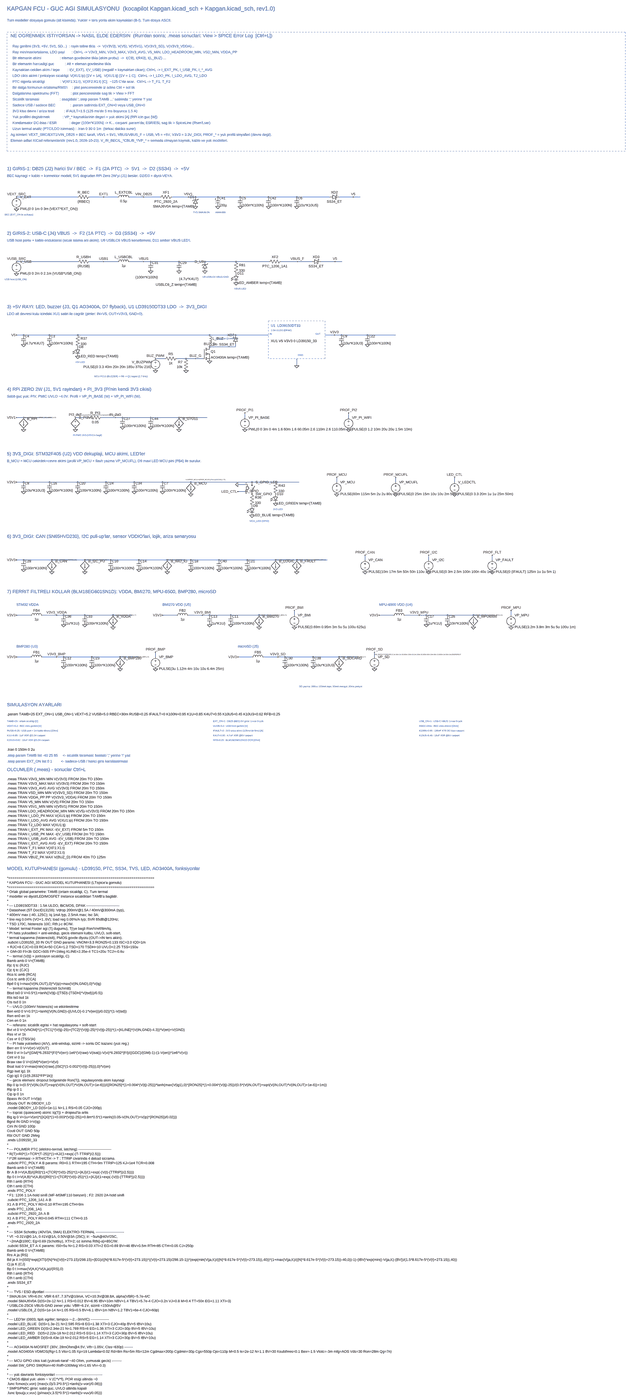
[diagram p0: schematic Kapgan_Guc_Agi.asc, whole sheet]
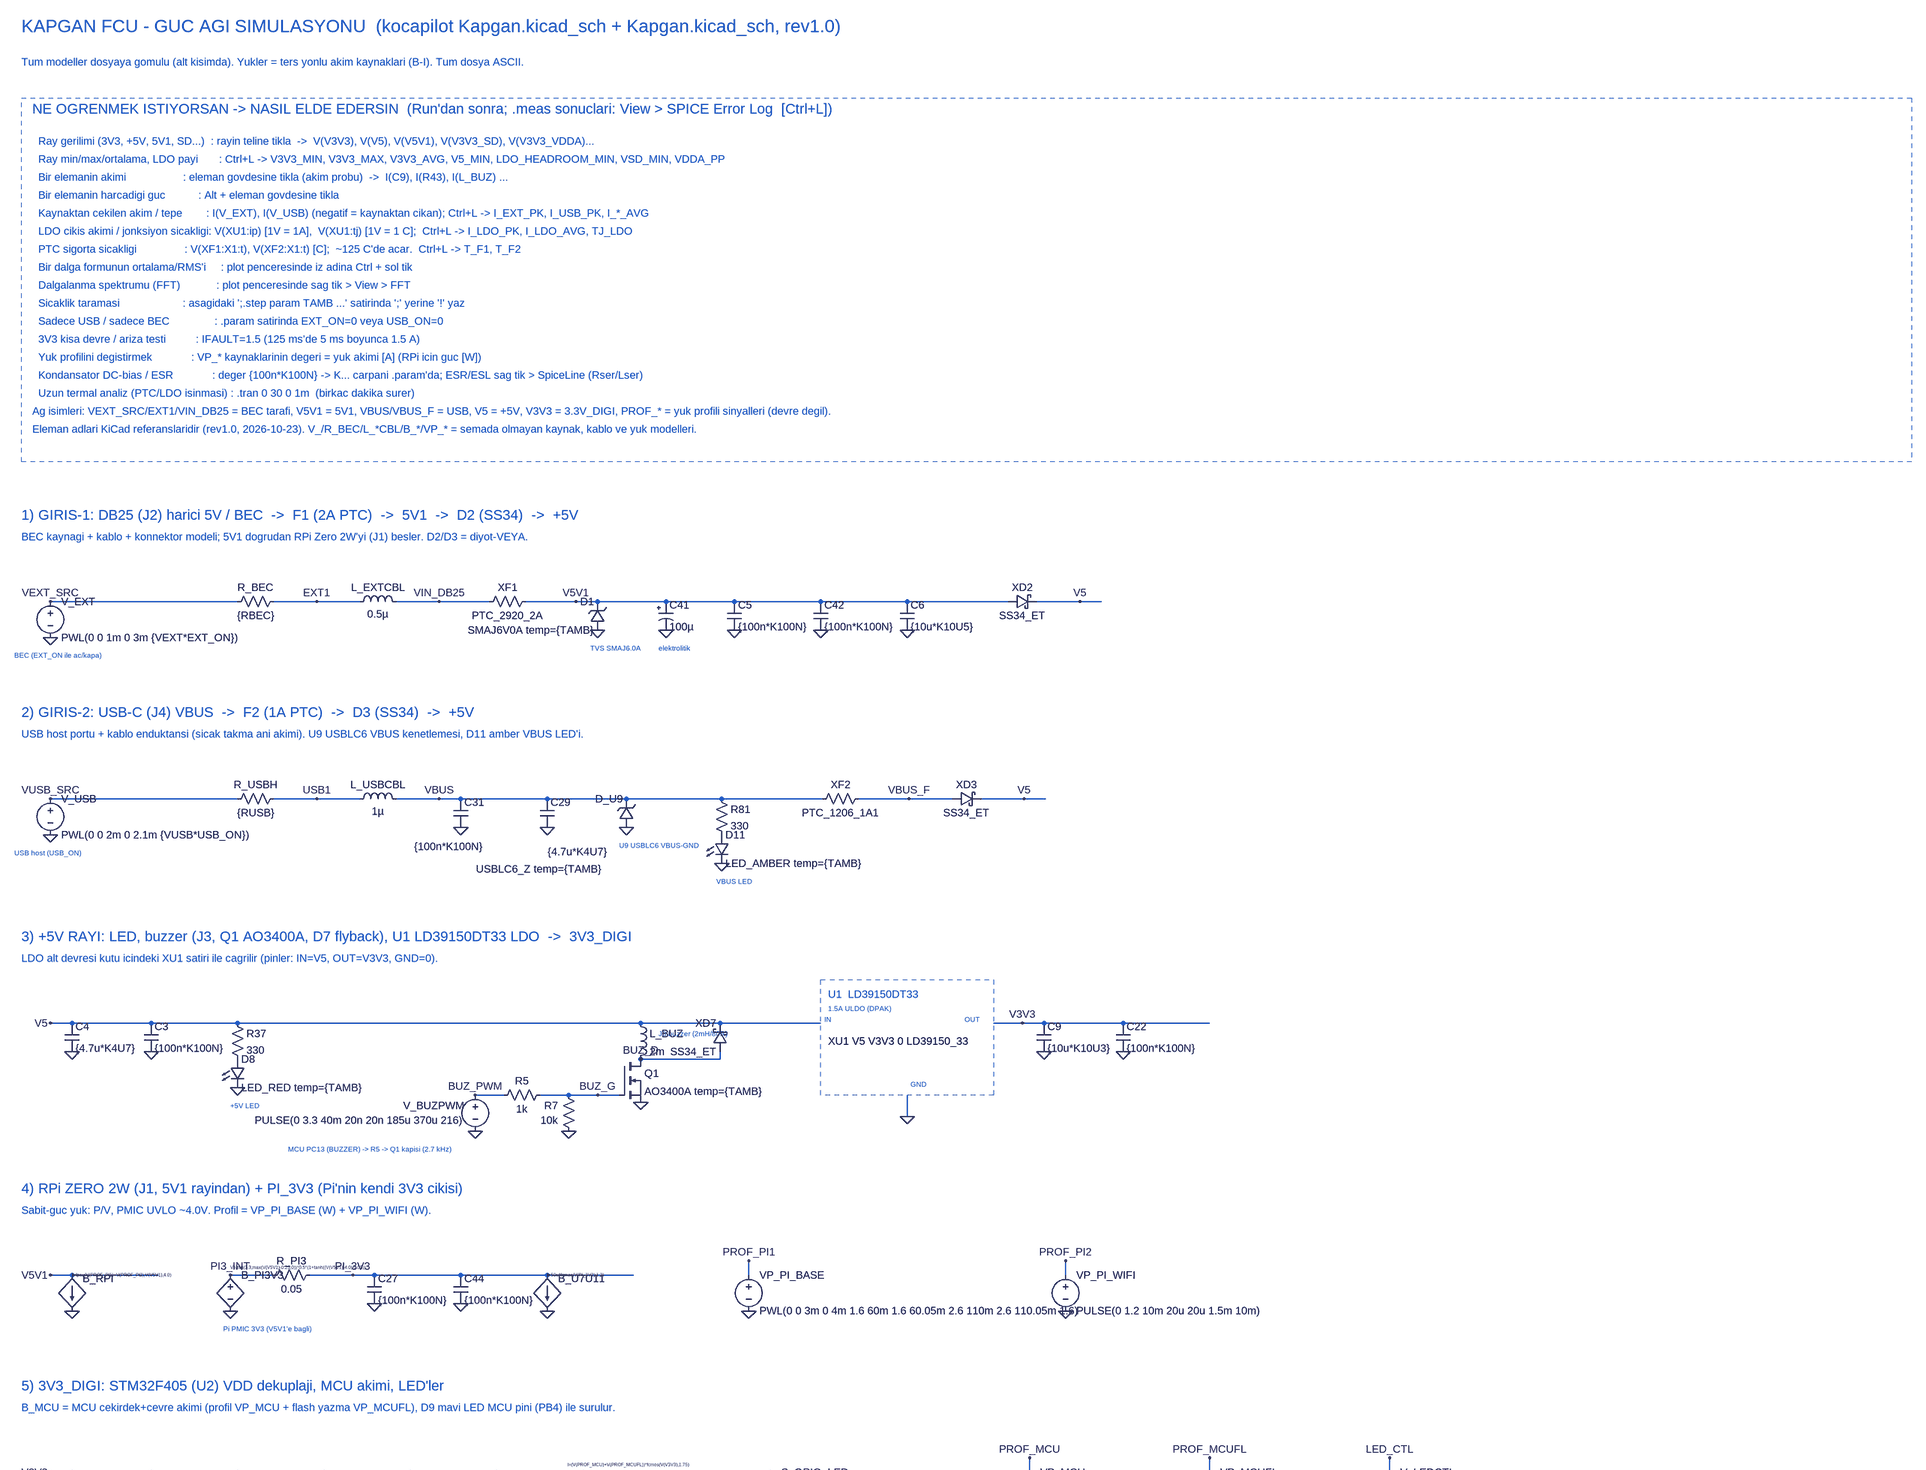
[diagram p1: schematic Kapgan_Guc_Agi.asc, part, row 1 of 3, column 1 of 1]
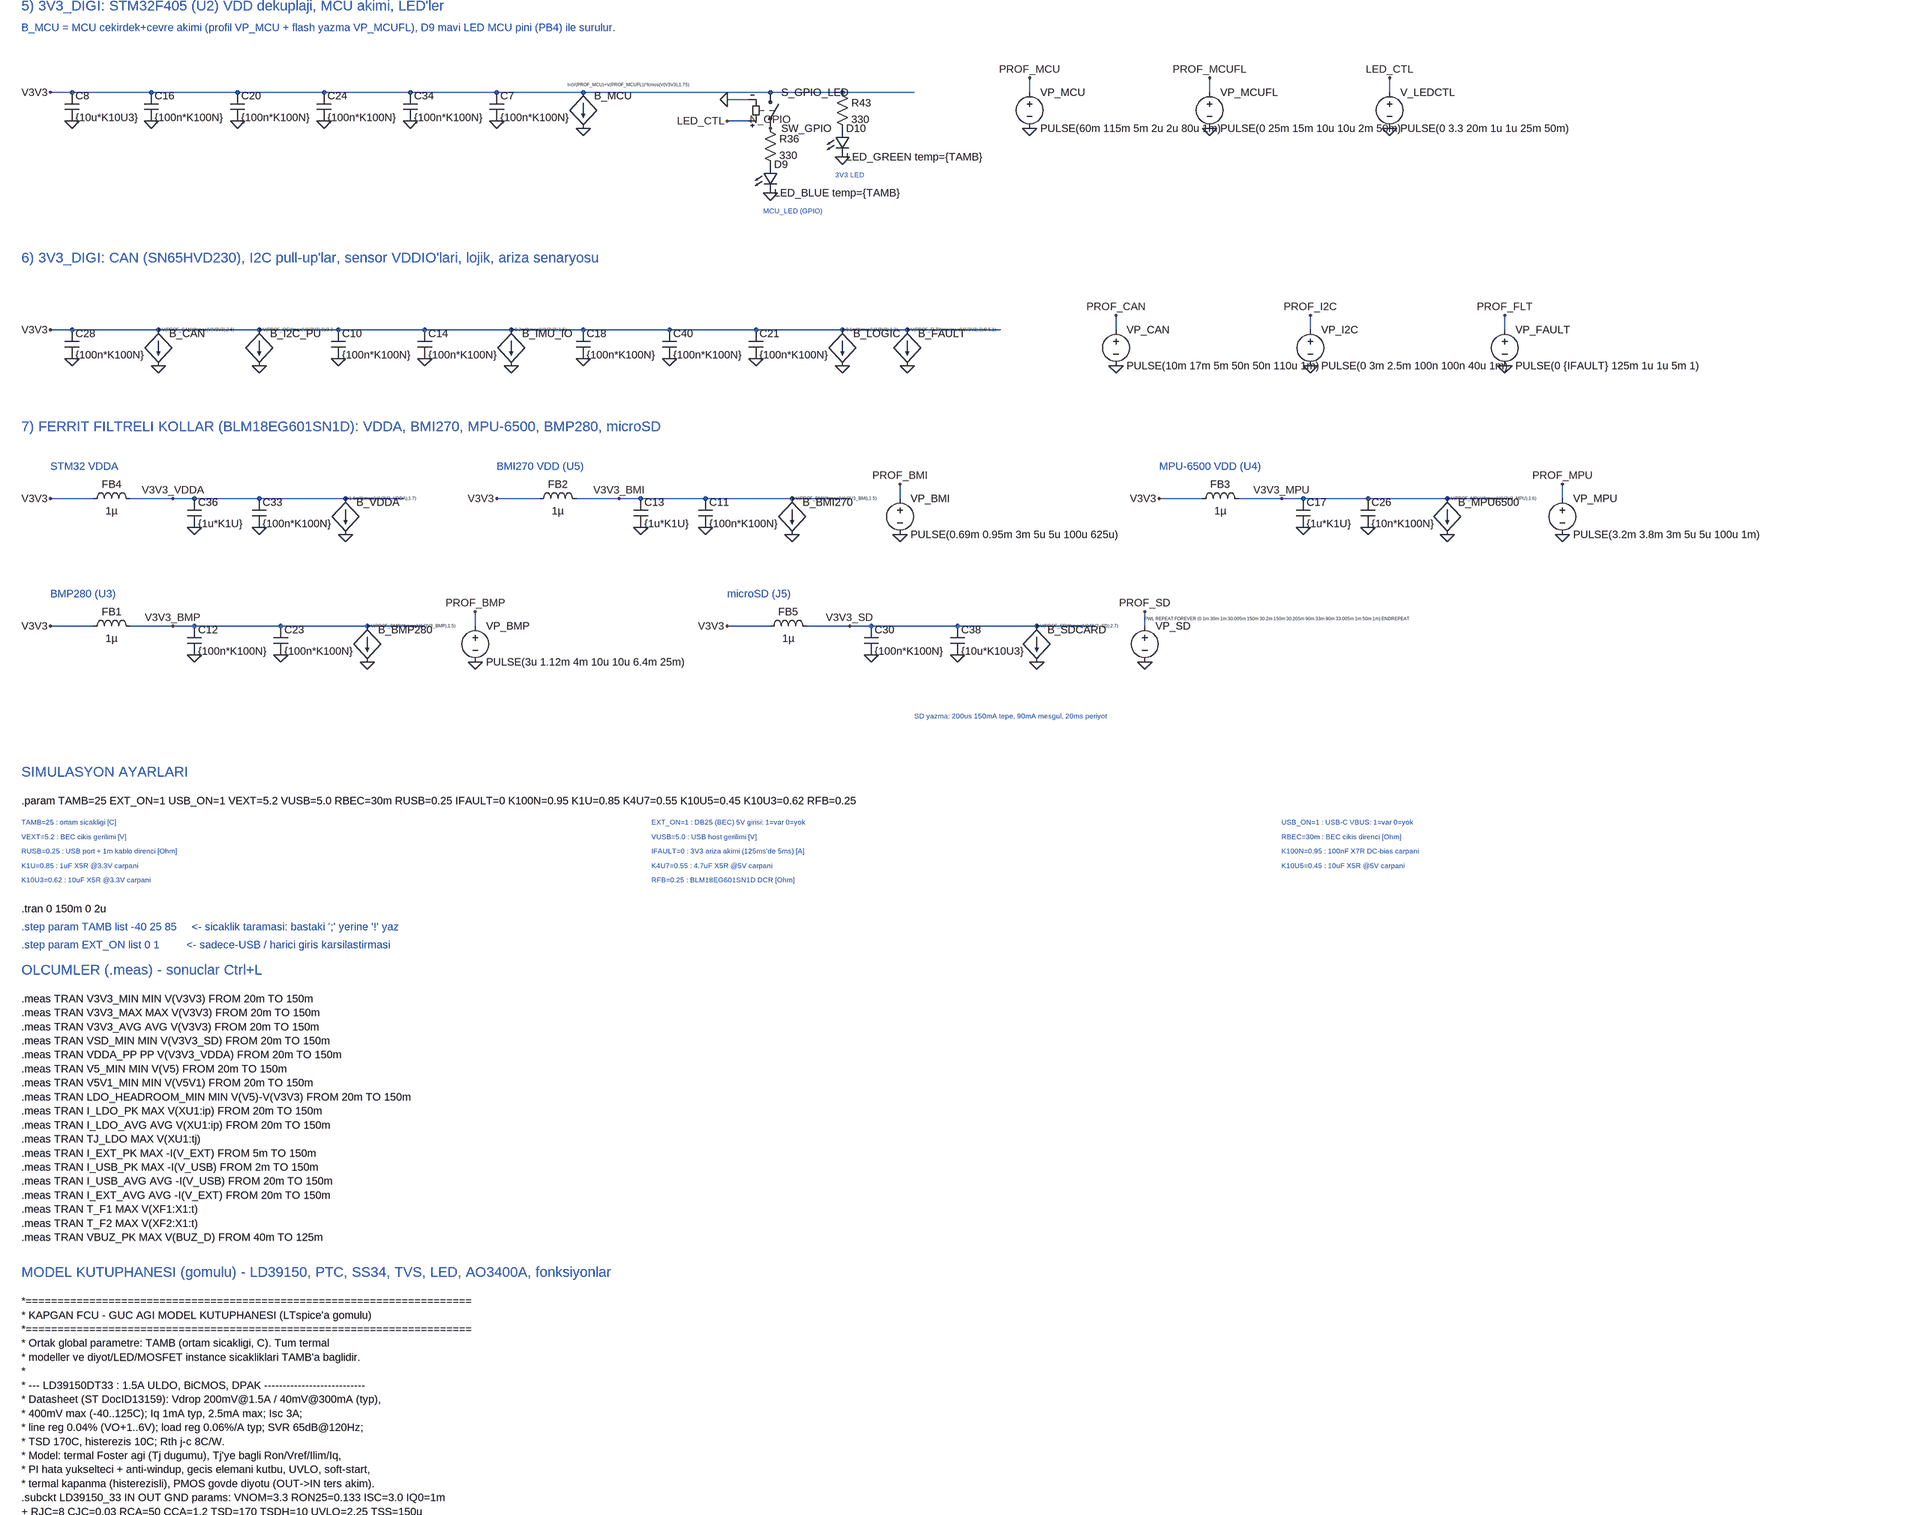
[diagram p2: schematic Kapgan_Guc_Agi.asc, part, row 2 of 3, column 1 of 1]
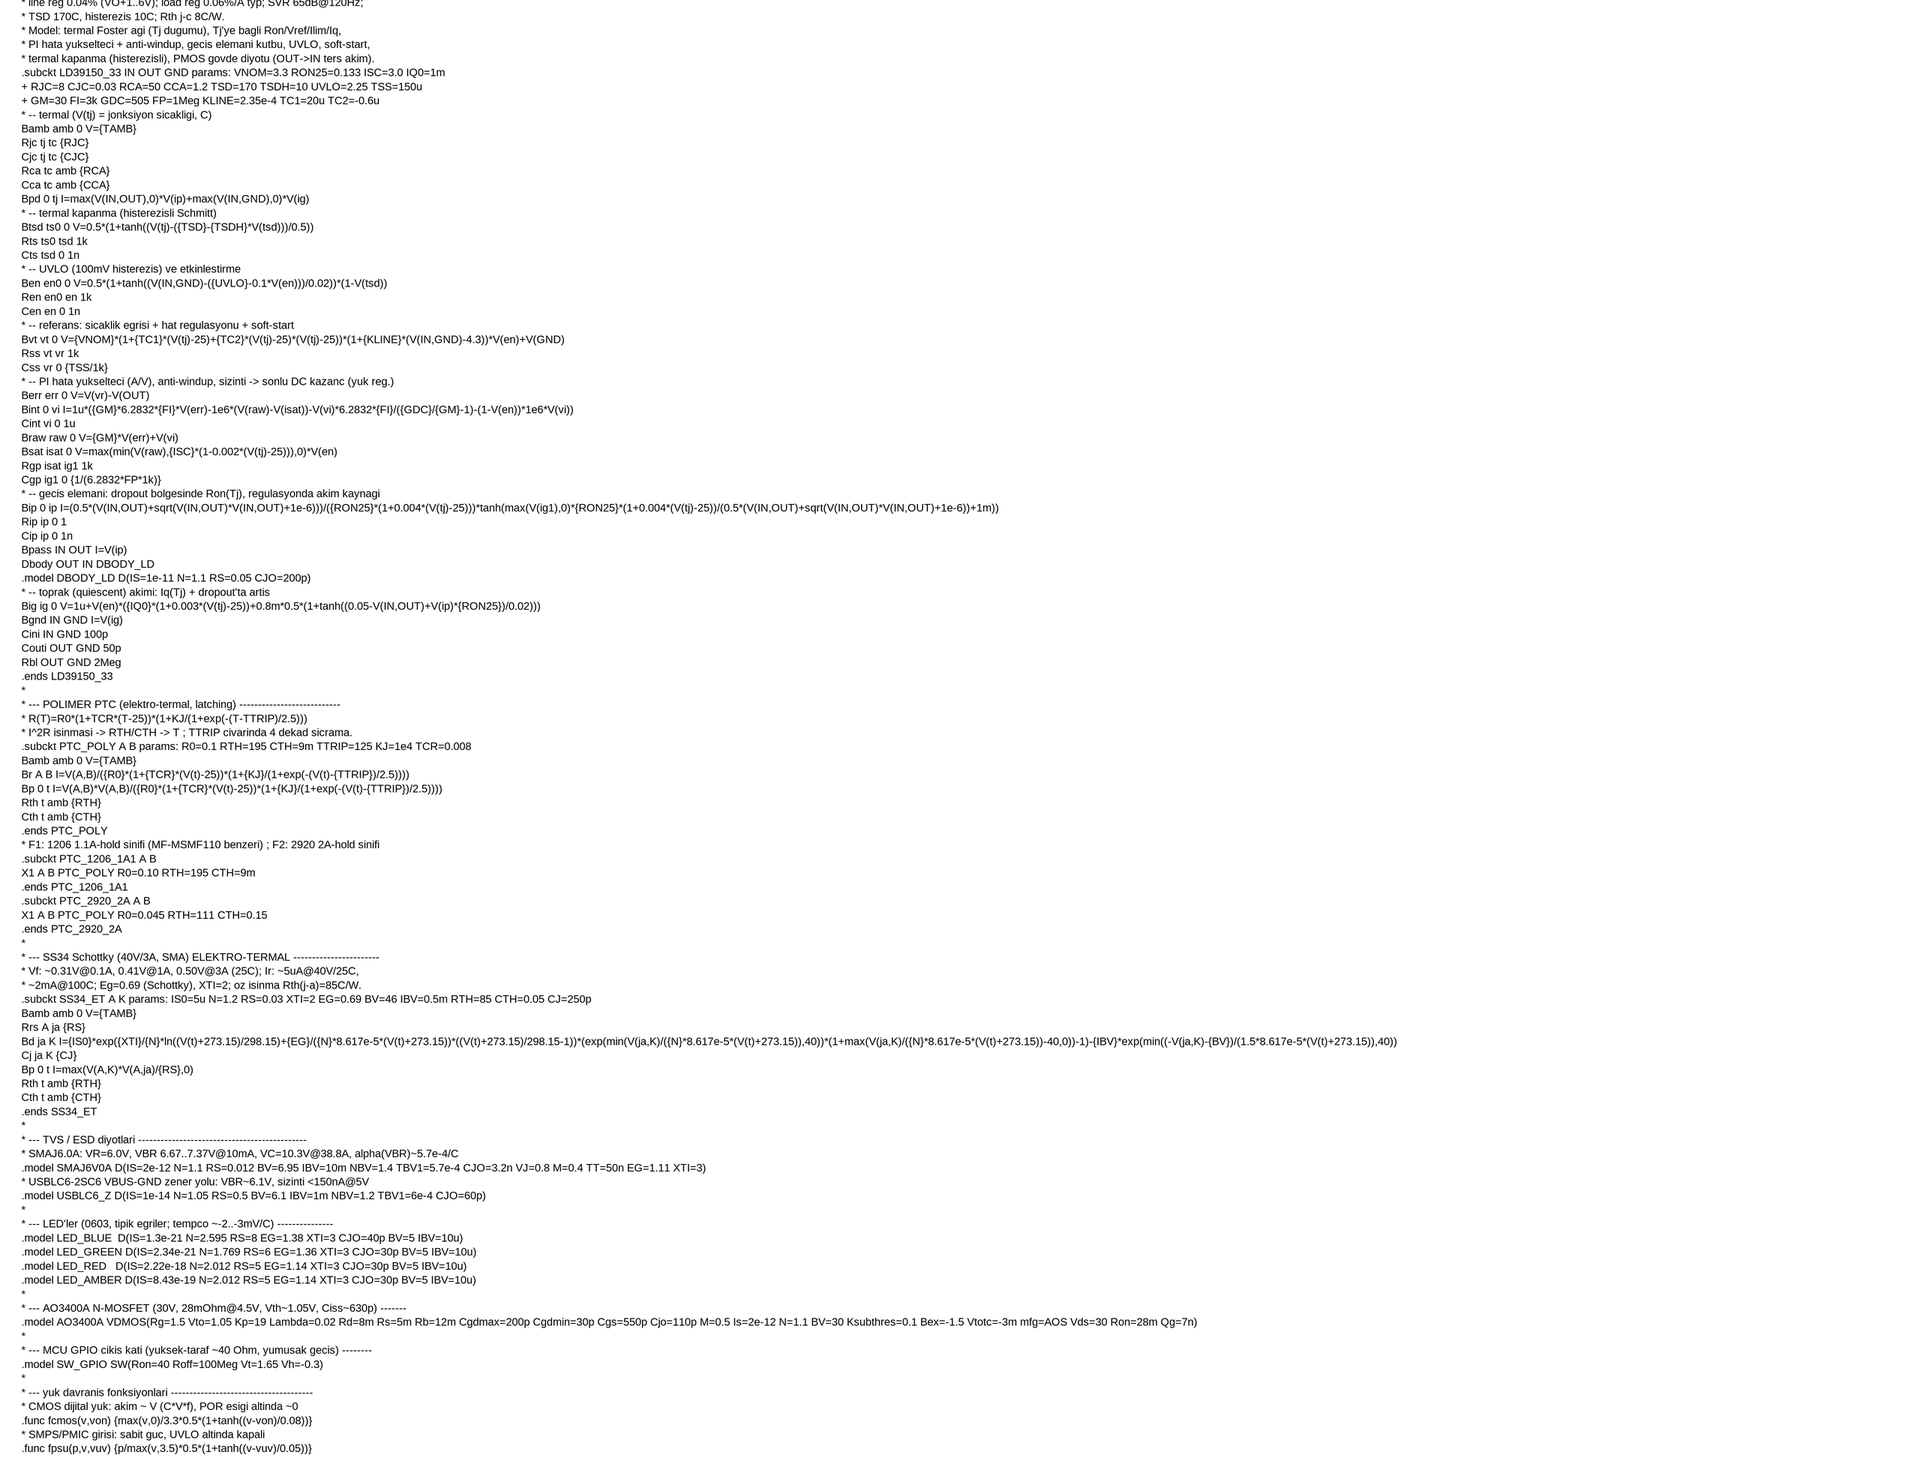
[diagram p3: schematic Kapgan_Guc_Agi.asc, part, row 3 of 3, column 1 of 1]
Kapgan_Guc_Agi.asc, the LTspice schematic file:
Version 4.1
SHEET 1 58928 9632
WIRE 480 1192 64 1192
WIRE 656 1192 560 1192
WIRE 752 1192 656 1192
WIRE 928 1192 832 1192
WIRE 1040 1192 928 1192
WIRE 1232 1192 1120 1192
WIRE 1280 1192 1232 1192
WIRE 1432 1192 1280 1192
WIRE 1584 1192 1432 1192
WIRE 1776 1192 1584 1192
WIRE 1968 1192 1776 1192
WIRE 2192 1192 1968 1192
WIRE 2352 1192 2256 1192
WIRE 2400 1192 2352 1192
WIRE 480 1712 64 1712
WIRE 656 1712 560 1712
WIRE 752 1712 656 1712
WIRE 928 1712 832 1712
WIRE 976 1712 928 1712
WIRE 1168 1712 976 1712
WIRE 1344 1712 1168 1712
WIRE 1556 1712 1344 1712
WIRE 1780 1712 1556 1712
WIRE 1972 1712 1860 1712
WIRE 2068 1712 1972 1712
WIRE 2228 1712 2132 1712
WIRE 2276 1712 2228 1712
WIRE 112 2232 64 2232
WIRE 288 2232 112 2232
WIRE 480 2232 288 2232
WIRE 1376 2232 480 2232
WIRE 1552 2232 1376 2232
WIRE 1776 2232 1552 2232
WIRE 2224 2232 2160 2232
WIRE 2272 2232 2224 2232
WIRE 2448 2232 2272 2232
WIRE 2640 2232 2448 2232
WIRE 1552 2312 1552 2296
WIRE 1552 2312 1376 2312
WIRE 1072 2392 1008 2392
WIRE 1216 2392 1152 2392
WIRE 1280 2392 1216 2392
WIRE 1328 2392 1280 2392
WIRE 1968 2440 1968 2392
WIRE 112 2792 64 2792
WIRE 304 2792 112 2792
WIRE 560 2792 464 2792
WIRE 736 2792 640 2792
WIRE 784 2792 736 2792
WIRE 976 2792 784 2792
WIRE 1168 2792 976 2792
WIRE 1360 2792 1168 2792
WIRE 1616 2792 1616 2760
WIRE 2320 2792 2320 2760
WIRE 112 3312 64 3312
WIRE 288 3312 112 3312
WIRE 480 3312 288 3312
WIRE 672 3312 480 3312
WIRE 864 3312 672 3312
WIRE 1056 3312 864 3312
WIRE 1248 3312 1056 3312
WIRE 1664 3312 1248 3312
WIRE 1824 3312 1664 3312
WIRE 1984 3312 1824 3312
WIRE 2240 3312 2240 3280
WIRE 2640 3312 2640 3280
WIRE 3040 3312 3040 3280
WIRE 1616 3328 1568 3328
WIRE 1616 3376 1568 3376
WIRE 112 3840 64 3840
WIRE 304 3840 112 3840
WIRE 528 3840 304 3840
WIRE 704 3840 528 3840
WIRE 896 3840 704 3840
WIRE 1088 3840 896 3840
WIRE 1248 3840 1088 3840
WIRE 1440 3840 1248 3840
WIRE 1632 3840 1440 3840
WIRE 1824 3840 1632 3840
WIRE 1968 3840 1824 3840
WIRE 2176 3840 1968 3840
WIRE 2432 3840 2432 3808
WIRE 2864 3840 2864 3808
WIRE 3296 3840 3296 3808
WIRE 160 4360 64 4360
WIRE 336 4360 240 4360
WIRE 384 4360 336 4360
WIRE 528 4360 384 4360
WIRE 720 4360 528 4360
WIRE 848 4360 720 4360
WIRE 1152 4360 1056 4360
WIRE 1328 4360 1232 4360
WIRE 1376 4360 1328 4360
WIRE 1520 4360 1376 4360
WIRE 1712 4360 1520 4360
WIRE 1840 4360 1712 4360
WIRE 1952 4360 1952 4328
WIRE 2624 4360 2528 4360
WIRE 2800 4360 2704 4360
WIRE 2848 4360 2800 4360
WIRE 2992 4360 2848 4360
WIRE 3168 4360 2992 4360
WIRE 3312 4360 3168 4360
WIRE 3424 4360 3424 4328
WIRE 160 4840 64 4840
WIRE 336 4840 240 4840
WIRE 384 4840 336 4840
WIRE 576 4840 384 4840
WIRE 768 4840 576 4840
WIRE 896 4840 768 4840
WIRE 1008 4840 1008 4808
WIRE 1664 4840 1568 4840
WIRE 1840 4840 1744 4840
WIRE 1888 4840 1840 4840
WIRE 2080 4840 1888 4840
WIRE 2256 4840 2080 4840
WIRE 2384 4840 2256 4840
WIRE 2496 4840 2496 4808
FLAG 64 1192 VEXT_SRC
FLAG 64 1272 0
FLAG 656 1192 EXT1
FLAG 928 1192 VIN_DB25
FLAG 1232 1192 V5V1
FLAG 1280 1256 0
FLAG 1432 1256 0
FLAG 1584 1256 0
FLAG 1776 1256 0
FLAG 1968 1256 0
FLAG 2352 1192 V5
FLAG 64 1712 VUSB_SRC
FLAG 64 1792 0
FLAG 656 1712 USB1
FLAG 928 1712 VBUS
FLAG 976 1776 0
FLAG 1168 1776 0
FLAG 1344 1776 0
FLAG 1556 1856 0
FLAG 1972 1712 VBUS_F
FLAG 2228 1712 V5
FLAG 64 2232 V5
FLAG 112 2296 0
FLAG 288 2296 0
FLAG 480 2376 0
FLAG 1376 2312 BUZ_D
FLAG 1376 2408 0
FLAG 1280 2392 BUZ_G
FLAG 1216 2472 0
FLAG 1008 2392 BUZ_PWM
FLAG 1008 2472 0
FLAG 1968 2440 0
FLAG 2224 2232 V3V3
FLAG 2272 2296 0
FLAG 2448 2296 0
FLAG 64 2792 V5V1
FLAG 112 2872 0
FLAG 464 2872 0
FLAG 464 2792 PI3_INT
FLAG 736 2792 PI_3V3
FLAG 784 2856 0
FLAG 976 2856 0
FLAG 1168 2872 0
FLAG 1616 2760 PROF_PI1
FLAG 1616 2872 0
FLAG 2320 2760 PROF_PI2
FLAG 2320 2872 0
FLAG 64 3312 V3V3
FLAG 112 3376 0
FLAG 288 3376 0
FLAG 480 3376 0
FLAG 672 3376 0
FLAG 864 3376 0
FLAG 1056 3376 0
FLAG 1248 3392 0
FLAG 1568 3376 LED_CTL
FLAG 1568 3328 0
FLAG 1664 3392 N_GPIO
FLAG 1664 3536 0
FLAG 1824 3456 0
FLAG 2240 3280 PROF_MCU
FLAG 2240 3392 0
FLAG 2640 3280 PROF_MCUFL
FLAG 2640 3392 0
FLAG 3040 3280 LED_CTL
FLAG 3040 3392 0
FLAG 64 3840 V3V3
FLAG 112 3904 0
FLAG 304 3920 0
FLAG 528 3920 0
FLAG 704 3904 0
FLAG 896 3904 0
FLAG 1088 3920 0
FLAG 1248 3904 0
FLAG 1440 3904 0
FLAG 1632 3904 0
FLAG 1824 3920 0
FLAG 1968 3920 0
FLAG 2432 3808 PROF_CAN
FLAG 2432 3920 0
FLAG 2864 3808 PROF_I2C
FLAG 2864 3920 0
FLAG 3296 3808 PROF_FLT
FLAG 3296 3920 0
FLAG 64 4360 V3V3
FLAG 336 4360 V3V3_VDDA
FLAG 384 4424 0
FLAG 528 4424 0
FLAG 720 4440 0
FLAG 1056 4360 V3V3
FLAG 1328 4360 V3V3_BMI
FLAG 1376 4424 0
FLAG 1520 4424 0
FLAG 1712 4440 0
FLAG 1952 4328 PROF_BMI
FLAG 1952 4440 0
FLAG 2528 4360 V3V3
FLAG 2800 4360 V3V3_MPU
FLAG 2848 4424 0
FLAG 2992 4424 0
FLAG 3168 4440 0
FLAG 3424 4328 PROF_MPU
FLAG 3424 4440 0
FLAG 64 4840 V3V3
FLAG 336 4840 V3V3_BMP
FLAG 384 4904 0
FLAG 576 4904 0
FLAG 768 4920 0
FLAG 1008 4808 PROF_BMP
FLAG 1008 4920 0
FLAG 1568 4840 V3V3
FLAG 1840 4840 V3V3_SD
FLAG 1888 4904 0
FLAG 2080 4904 0
FLAG 2256 4920 0
FLAG 2496 4808 PROF_SD
FLAG 2496 4920 0
SYMBOL voltage 64 1176 R0
SYMATTR InstName V_EXT
SYMATTR Value PWL(0 0 1m 0 3m {VEXT*EXT_ON})
SYMBOL res 464 1208 R270
WINDOW 0 32 56 VTop 2
WINDOW 3 0 56 VBottom 2
SYMATTR InstName R_BEC
SYMATTR Value {RBEC}
SYMBOL ind 736 1208 R270
WINDOW 0 32 56 VTop 2
WINDOW 3 4 56 VBottom 2
SYMATTR InstName L_EXTCBL
SYMATTR Value 0.5µ
SYMATTR SpiceLine Rser=15m
SYMBOL res 1024 1208 R270
WINDOW 0 32 56 VTop 2
WINDOW 3 0 56 VBottom 2
SYMATTR InstName XF1
SYMATTR Value PTC_2920_2A
SYMATTR Prefix X
SYMBOL zener 1296 1256 R180
WINDOW 0 24 64 Left 2
WINDOW 3 24 0 Left 2
SYMATTR InstName D1
SYMATTR Value SMAJ6V0A temp={TAMB}
SYMBOL polcap 1416 1192 R0
SYMATTR InstName C41
SYMATTR Value 100µ
SYMATTR SpiceLine V=16 Rser=0.34 Lser=3n Rpar=1Meg
SYMBOL cap 1568 1192 R0
SYMATTR InstName C5
SYMATTR Value {100n*K100N}
SYMATTR SpiceLine Rser=30m Lser=0.6n
SYMBOL cap 1760 1192 R0
SYMATTR InstName C42
SYMATTR Value {100n*K100N}
SYMATTR SpiceLine Rser=30m Lser=0.6n
SYMBOL cap 1952 1192 R0
SYMATTR InstName C6
SYMATTR Value {10u*K10U5}
SYMATTR SpiceLine Rser=4m Lser=0.8n
SYMBOL schottky 2192 1208 R270
WINDOW 0 32 32 VTop 2
WINDOW 3 0 32 VBottom 2
SYMATTR InstName XD2
SYMATTR Value SS34_ET
SYMATTR Prefix X
SYMBOL voltage 64 1696 R0
SYMATTR InstName V_USB
SYMATTR Value PWL(0 0 2m 0 2.1m {VUSB*USB_ON})
SYMBOL res 464 1728 R270
WINDOW 0 32 56 VTop 2
WINDOW 3 0 56 VBottom 2
SYMATTR InstName R_USBH
SYMATTR Value {RUSB}
SYMBOL ind 736 1728 R270
WINDOW 0 32 56 VTop 2
WINDOW 3 4 56 VBottom 2
SYMATTR InstName L_USBCBL
SYMATTR Value 1µ
SYMATTR SpiceLine Rser=0
SYMBOL cap 960 1712 R0
WINDOW 3 -88 106 Left 2
SYMATTR InstName C31
SYMATTR Value {100n*K100N}
SYMATTR SpiceLine Rser=30m Lser=0.6n
SYMBOL cap 1152 1712 R0
WINDOW 3 17 118 Left 2
SYMATTR InstName C29
SYMATTR Value {4.7u*K4U7}
SYMATTR SpiceLine Rser=6m Lser=0.75n
SYMBOL zener 1360 1776 R180
WINDOW 0 24 64 Left 2
WINDOW 3 70 -92 Left 2
SYMATTR InstName D_U9
SYMATTR Value USBLC6_Z temp={TAMB}
SYMBOL res 1540 1696 R0
SYMATTR InstName R81
SYMATTR Value 330
SYMBOL LED 1540 1792 R0
SYMATTR InstName D11
SYMATTR Value LED_AMBER temp={TAMB}
SYMBOL res 1764 1728 R270
WINDOW 0 32 56 VTop 2
WINDOW 3 0 56 VBottom 2
SYMATTR InstName XF2
SYMATTR Value PTC_1206_1A1
SYMATTR Prefix X
SYMBOL schottky 2068 1728 R270
WINDOW 0 32 32 VTop 2
WINDOW 3 0 32 VBottom 2
SYMATTR InstName XD3
SYMATTR Value SS34_ET
SYMATTR Prefix X
SYMBOL cap 96 2232 R0
SYMATTR InstName C4
SYMATTR Value {4.7u*K4U7}
SYMATTR SpiceLine Rser=6m Lser=0.75n
SYMBOL cap 272 2232 R0
SYMATTR InstName C3
SYMATTR Value {100n*K100N}
SYMATTR SpiceLine Rser=30m Lser=0.6n
SYMBOL res 464 2216 R0
SYMATTR InstName R37
SYMATTR Value 330
SYMBOL LED 464 2312 R0
SYMATTR InstName D8
SYMATTR Value LED_RED temp={TAMB}
SYMBOL ind 1360 2216 R0
SYMATTR InstName L_BUZ
SYMATTR Value 2m
SYMATTR SpiceLine Rser=80 Rpar=5k
SYMBOL schottky 1568 2296 R180
WINDOW 0 24 64 Left 2
WINDOW 3 24 0 Left 2
SYMATTR InstName XD7
SYMATTR Value SS34_ET
SYMATTR Prefix X
SYMBOL nmos 1328 2312 R0
SYMATTR InstName Q1
SYMATTR Value AO3400A temp={TAMB}
SYMBOL res 1200 2376 R0
WINDOW 0 -8 40 Right 2
WINDOW 3 -8 72 Right 2
SYMATTR InstName R7
SYMATTR Value 10k
SYMBOL res 1056 2408 R270
WINDOW 0 32 56 VTop 2
WINDOW 3 0 56 VBottom 2
SYMATTR InstName R5
SYMATTR Value 1k
SYMBOL voltage 1008 2376 R0
WINDOW 0 -24 40 Right 2
WINDOW 3 -24 72 Right 2
SYMATTR InstName V_BUZPWM
SYMATTR Value PULSE(0 3.3 40m 20n 20n 185u 370u 216)
SYMBOL cap 2256 2232 R0
SYMATTR InstName C9
SYMATTR Value {10u*K10U3}
SYMATTR SpiceLine Rser=4m Lser=0.8n
SYMBOL cap 2432 2232 R0
SYMATTR InstName C22
SYMATTR Value {100n*K100N}
SYMATTR SpiceLine Rser=30m Lser=0.6n
SYMBOL bi 112 2792 R0
WINDOW 0 24 8 Left 2
WINDOW 3 0 0 Left 0
SYMATTR InstName B_RPI
SYMATTR Value I=fpsu(V(PROF_PI1)+V(PROF_PI2),V(V5V1),4.0)
SYMBOL bv 464 2776 R0
WINDOW 3 0 0 Left 0
SYMATTR InstName B_PI3V3
SYMATTR Value V=min(3.3,max(V(V5V1)-0.25,0))*0.5*(1+tanh((V(V5V1)-4.0)/0.05))
SYMBOL res 544 2808 R270
WINDOW 0 32 56 VTop 2
WINDOW 3 0 56 VBottom 2
SYMATTR InstName R_PI3
SYMATTR Value 0.05
SYMBOL cap 768 2792 R0
SYMATTR InstName C27
SYMATTR Value {100n*K100N}
SYMATTR SpiceLine Rser=30m Lser=0.6n
SYMBOL cap 960 2792 R0
SYMATTR InstName C44
SYMATTR Value {100n*K100N}
SYMATTR SpiceLine Rser=30m Lser=0.6n
SYMBOL bi 1168 2792 R0
WINDOW 0 24 8 Left 2
WINDOW 3 0 0 Left 0
SYMATTR InstName B_U7U11
SYMATTR Value I=50u*fcmos(V(PI_3V3),1.2)
SYMBOL voltage 1616 2776 R0
SYMATTR InstName VP_PI_BASE
SYMATTR Value PWL(0 0 3m 0 4m 1.6 60m 1.6 60.05m 2.6 110m 2.6 110.05m 1.6)
SYMBOL voltage 2320 2776 R0
SYMATTR InstName VP_PI_WIFI
SYMATTR Value PULSE(0 1.2 10m 20u 20u 1.5m 10m)
SYMBOL cap 96 3312 R0
SYMATTR InstName C8
SYMATTR Value {10u*K10U3}
SYMATTR SpiceLine Rser=4m Lser=0.8n
SYMBOL cap 272 3312 R0
SYMATTR InstName C16
SYMATTR Value {100n*K100N}
SYMATTR SpiceLine Rser=30m Lser=0.6n
SYMBOL cap 464 3312 R0
SYMATTR InstName C20
SYMATTR Value {100n*K100N}
SYMATTR SpiceLine Rser=30m Lser=0.6n
SYMBOL cap 656 3312 R0
SYMATTR InstName C24
SYMATTR Value {100n*K100N}
SYMATTR SpiceLine Rser=30m Lser=0.6n
SYMBOL cap 848 3312 R0
SYMATTR InstName C34
SYMATTR Value {100n*K100N}
SYMATTR SpiceLine Rser=30m Lser=0.6n
SYMBOL cap 1040 3312 R0
SYMATTR InstName C7
SYMATTR Value {100n*K100N}
SYMATTR SpiceLine Rser=30m Lser=0.6n
SYMBOL bi 1248 3312 R0
WINDOW 0 24 8 Left 2
WINDOW 3 -35 -16 Left 0
SYMATTR InstName B_MCU
SYMATTR Value I=(V(PROF_MCU)+V(PROF_MCUFL))*fcmos(V(V3V3),1.75)
SYMBOL sw 1664 3296 R0
SYMATTR InstName S_GPIO_LED
SYMATTR Value SW_GPIO
SYMBOL res 1648 3376 R0
SYMATTR InstName R36
SYMATTR Value 330
SYMBOL LED 1648 3472 R0
SYMATTR InstName D9
SYMATTR Value LED_BLUE temp={TAMB}
SYMBOL res 1808 3296 R0
SYMATTR InstName R43
SYMATTR Value 330
SYMBOL LED 1808 3392 R0
SYMATTR InstName D10
SYMATTR Value LED_GREEN temp={TAMB}
SYMBOL voltage 2240 3296 R0
SYMATTR InstName VP_MCU
SYMATTR Value PULSE(60m 115m 5m 2u 2u 80u 1m)
SYMBOL voltage 2640 3296 R0
SYMATTR InstName VP_MCUFL
SYMATTR Value PULSE(0 25m 15m 10u 10u 2m 50m)
SYMBOL voltage 3040 3296 R0
SYMATTR InstName V_LEDCTL
SYMATTR Value PULSE(0 3.3 20m 1u 1u 25m 50m)
SYMBOL cap 96 3840 R0
SYMATTR InstName C28
SYMATTR Value {100n*K100N}
SYMATTR SpiceLine Rser=30m Lser=0.6n
SYMBOL bi 304 3840 R0
WINDOW 0 24 8 Left 2
WINDOW 3 0 0 Left 0
SYMATTR InstName B_CAN
SYMATTR Value I=V(PROF_CAN)*fcmos(V(V3V3),2.6)
SYMBOL bi 528 3840 R0
WINDOW 0 24 8 Left 2
WINDOW 3 0 0 Left 0
SYMATTR InstName B_I2C_PU
SYMATTR Value I=V(PROF_I2C)*max(V(V3V3),0)/3.3
SYMBOL cap 688 3840 R0
SYMATTR InstName C10
SYMATTR Value {100n*K100N}
SYMATTR SpiceLine Rser=30m Lser=0.6n
SYMBOL cap 880 3840 R0
SYMATTR InstName C14
SYMATTR Value {100n*K100N}
SYMATTR SpiceLine Rser=30m Lser=0.6n
SYMBOL bi 1088 3840 R0
WINDOW 0 24 8 Left 2
WINDOW 3 0 0 Left 0
SYMATTR InstName B_IMU_IO
SYMATTR Value I=0.3m*fcmos(V(V3V3),1.5)
SYMBOL cap 1232 3840 R0
SYMATTR InstName C18
SYMATTR Value {100n*K100N}
SYMATTR SpiceLine Rser=30m Lser=0.6n
SYMBOL cap 1424 3840 R0
SYMATTR InstName C40
SYMATTR Value {100n*K100N}
SYMATTR SpiceLine Rser=30m Lser=0.6n
SYMBOL cap 1616 3840 R0
SYMATTR InstName C21
SYMATTR Value {100n*K100N}
SYMATTR SpiceLine Rser=30m Lser=0.6n
SYMBOL bi 1824 3840 R0
WINDOW 0 24 8 Left 2
WINDOW 3 0 0 Left 0
SYMATTR InstName B_LOGIC
SYMATTR Value I=0.1m*fcmos(V(V3V3),1.2)
SYMBOL bi 1968 3840 R0
WINDOW 0 24 8 Left 2
WINDOW 3 0 0 Left 0
SYMATTR InstName B_FAULT
SYMATTR Value I=V(PROF_FLT)*min(max(V(V3V3),0)/0.5,1)
SYMBOL voltage 2432 3824 R0
SYMATTR InstName VP_CAN
SYMATTR Value PULSE(10m 17m 5m 50n 50n 110u 1m)
SYMBOL voltage 2864 3824 R0
SYMATTR InstName VP_I2C
SYMATTR Value PULSE(0 3m 2.5m 100n 100n 40u 1m)
SYMBOL voltage 3296 3824 R0
SYMATTR InstName VP_FAULT
SYMATTR Value PULSE(0 {IFAULT} 125m 1u 1u 5m 1)
SYMBOL ind 144 4376 R270
WINDOW 0 32 56 VTop 2
WINDOW 3 4 56 VBottom 2
SYMATTR InstName FB4
SYMATTR Value 1µ
SYMATTR SpiceLine Rser={RFB} Rpar=650 Cpar=1.2p
SYMBOL cap 368 4360 R0
SYMATTR InstName C36
SYMATTR Value {1u*K1U}
SYMATTR SpiceLine Rser=12m Lser=0.6n
SYMBOL cap 512 4360 R0
SYMATTR InstName C33
SYMATTR Value {100n*K100N}
SYMATTR SpiceLine Rser=30m Lser=0.6n
SYMBOL bi 720 4360 R0
WINDOW 0 24 8 Left 2
WINDOW 3 0 0 Left 0
SYMATTR InstName B_VDDA
SYMATTR Value I=1.6m*fcmos(V(V3V3_VDDA),1.7)
SYMBOL ind 1136 4376 R270
WINDOW 0 32 56 VTop 2
WINDOW 3 4 56 VBottom 2
SYMATTR InstName FB2
SYMATTR Value 1µ
SYMATTR SpiceLine Rser={RFB} Rpar=650 Cpar=1.2p
SYMBOL cap 1360 4360 R0
SYMATTR InstName C13
SYMATTR Value {1u*K1U}
SYMATTR SpiceLine Rser=12m Lser=0.6n
SYMBOL cap 1504 4360 R0
SYMATTR InstName C11
SYMATTR Value {100n*K100N}
SYMATTR SpiceLine Rser=30m Lser=0.6n
SYMBOL bi 1712 4360 R0
WINDOW 0 24 8 Left 2
WINDOW 3 0 0 Left 0
SYMATTR InstName B_BMI270
SYMATTR Value I=V(PROF_BMI)*fcmos(V(V3V3_BMI),1.5)
SYMBOL voltage 1952 4344 R0
SYMATTR InstName VP_BMI
SYMATTR Value PULSE(0.69m 0.95m 3m 5u 5u 100u 625u)
SYMBOL ind 2608 4376 R270
WINDOW 0 32 56 VTop 2
WINDOW 3 4 56 VBottom 2
SYMATTR InstName FB3
SYMATTR Value 1µ
SYMATTR SpiceLine Rser={RFB} Rpar=650 Cpar=1.2p
SYMBOL cap 2832 4360 R0
SYMATTR InstName C17
SYMATTR Value {1u*K1U}
SYMATTR SpiceLine Rser=12m Lser=0.6n
SYMBOL cap 2976 4360 R0
SYMATTR InstName C26
SYMATTR Value {10n*K100N}
SYMATTR SpiceLine Rser=60m Lser=0.6n
SYMBOL bi 3168 4360 R0
WINDOW 0 24 8 Left 2
WINDOW 3 0 0 Left 0
SYMATTR InstName B_MPU6500
SYMATTR Value I=V(PROF_MPU)*fcmos(V(V3V3_MPU),1.6)
SYMBOL voltage 3424 4344 R0
SYMATTR InstName VP_MPU
SYMATTR Value PULSE(3.2m 3.8m 3m 5u 5u 100u 1m)
SYMBOL ind 144 4856 R270
WINDOW 0 32 56 VTop 2
WINDOW 3 4 56 VBottom 2
SYMATTR InstName FB1
SYMATTR Value 1µ
SYMATTR SpiceLine Rser={RFB} Rpar=650 Cpar=1.2p
SYMBOL cap 368 4840 R0
SYMATTR InstName C12
SYMATTR Value {100n*K100N}
SYMATTR SpiceLine Rser=30m Lser=0.6n
SYMBOL cap 560 4840 R0
SYMATTR InstName C23
SYMATTR Value {100n*K100N}
SYMATTR SpiceLine Rser=30m Lser=0.6n
SYMBOL bi 768 4840 R0
WINDOW 0 24 8 Left 2
WINDOW 3 0 0 Left 0
SYMATTR InstName B_BMP280
SYMATTR Value I=V(PROF_BMP)*fcmos(V(V3V3_BMP),1.5)
SYMBOL voltage 1008 4824 R0
SYMATTR InstName VP_BMP
SYMATTR Value PULSE(3u 1.12m 4m 10u 10u 6.4m 25m)
SYMBOL ind 1648 4856 R270
WINDOW 0 32 56 VTop 2
WINDOW 3 4 56 VBottom 2
SYMATTR InstName FB5
SYMATTR Value 1µ
SYMATTR SpiceLine Rser={RFB} Rpar=650 Cpar=1.2p
SYMBOL cap 1872 4840 R0
SYMATTR InstName C30
SYMATTR Value {100n*K100N}
SYMATTR SpiceLine Rser=30m Lser=0.6n
SYMBOL cap 2064 4840 R0
SYMATTR InstName C38
SYMATTR Value {10u*K10U3}
SYMATTR SpiceLine Rser=4m Lser=0.8n
SYMBOL bi 2256 4840 R0
WINDOW 0 24 8 Left 2
WINDOW 3 0 0 Left 0
SYMATTR InstName B_SDCARD
SYMATTR Value I=V(PROF_SD)*fcmos(V(V3V3_SD),2.7)
SYMBOL voltage 2496 4824 R0
WINDOW 3 0 0 Left 0
SYMATTR InstName VP_SD
SYMATTR Value PWL REPEAT FOREVER (0 1m 30m 1m 30.005m 150m 30.2m 150m 30.205m 90m 33m 90m 33.005m 1m 50m 1m) ENDREPEAT
TEXT 0 1000 Left 3 ;1) GIRIS-1: DB25 (J2) harici 5V / BEC  ->  F1 (2A PTC)  ->  5V1  ->  D2 (SS34)  ->  +5V
TEXT 0 1048 Left 2 ;BEC kaynagi + kablo + konnektor modeli; 5V1 dogrudan RPi Zero 2W'yi (J1) besler. D2/D3 = diyot-VEYA.
TEXT -16 1312 Left 1 ;BEC (EXT_ON ile ac/kapa)
TEXT 1264 1296 Left 1 ;TVS SMAJ6.0A
TEXT 1416 1296 Left 1 ;elektrolitik
TEXT 0 1520 Left 3 ;2) GIRIS-2: USB-C (J4) VBUS  ->  F2 (1A PTC)  ->  D3 (SS34)  ->  +5V
TEXT 0 1568 Left 2 ;USB host portu + kablo enduktansi (sicak takma ani akimi). U9 USBLC6 VBUS kenetlemesi, D11 amber VBUS LED'i.
TEXT -16 1832 Left 1 ;USB host (USB_ON)
TEXT 1328 1816 Left 1 ;U9 USBLC6 VBUS-GND
TEXT 1544 1896 Left 1 ;VBUS LED
TEXT 0 2040 Left 3 ;3) +5V RAYI: LED, buzzer (J3, Q1 AO3400A, D7 flyback), U1 LD39150DT33 LDO  ->  3V3_DIGI
TEXT 0 2088 Left 2 ;LDO alt devresi kutu icindeki XU1 satiri ile cagrilir (pinler: IN=V5, OUT=V3V3, GND=0).
TEXT 464 2416 Left 1 ;+5V LED
TEXT 592 2512 Left 1 ;MCU PC13 (BUZZER) -> R5 -> Q1 kapisi (2.7 kHz)
TEXT 1416 2256 Left 1 ;J3 buzzer (2mH/80R)
TEXT 1792 2168 Left 2 ;U1  LD39150DT33
TEXT 1792 2200 Left 1 ;1.5A ULDO (DPAK)
TEXT 1792 2272 Left 2 !XU1 V5 V3V3 0 LD39150_33
TEXT 1784 2224 Left 1 ;IN
TEXT 2096 2224 Left 1 ;OUT
TEXT 1976 2368 Left 1 ;GND
TEXT 0 2600 Left 3 ;4) RPi ZERO 2W (J1, 5V1 rayindan) + PI_3V3 (Pi'nin kendi 3V3 cikisi)
TEXT 0 2648 Left 2 ;Sabit-guc yuk: P/V, PMIC UVLO ~4.0V. Profil = VP_PI_BASE (W) + VP_PI_WIFI (W).
TEXT 448 2912 Left 1 ;Pi PMIC 3V3 (V5V1'e bagli)
TEXT 0 3120 Left 3 ;5) 3V3_DIGI: STM32F405 (U2) VDD dekuplaji, MCU akimi, LED'ler
TEXT 0 3168 Left 2 ;B_MCU = MCU cekirdek+cevre akimi (profil VP_MCU + flash yazma VP_MCUFL), D9 mavi LED MCU pini (PB4) ile surulur.
TEXT 1648 3576 Left 1 ;MCU_LED (GPIO)
TEXT 1808 3496 Left 1 ;3V3 LED
TEXT 0 3680 Left 3 ;6) 3V3_DIGI: CAN (SN65HVD230), I2C pull-up'lar, sensor VDDIO'lari, lojik, ariza senaryosu
TEXT 0 4200 Left 3 ;7) FERRIT FILTRELI KOLLAR (BLM18EG601SN1D): VDDA, BMI270, MPU-6500, BMP280, microSD
TEXT 64 4288 Left 2 ;STM32 VDDA
TEXT 1056 4288 Left 2 ;BMI270 VDD (U5)
TEXT 2528 4288 Left 2 ;MPU-6500 VDD (U4)
TEXT 64 4768 Left 2 ;BMP280 (U3)
TEXT 1568 4768 Left 2 ;microSD (J5)
TEXT 1984 5040 Left 1 ;SD yazma: 200us 150mA tepe, 90mA mesgul, 20ms periyot
TEXT 0 -160 Left 4 ;KAPGAN FCU - GUC AGI SIMULASYONU  (kocapilot Kapgan.kicad_sch + Kapgan.kicad_sch, rev1.0)
TEXT 0 -80 Left 2 ;Tum modeller dosyaya gomulu (alt kisimda). Yukler = ters yonlu akim kaynaklari (B-I). Tum dosya ASCII.
TEXT 24 24 Left 3 ;NE OGRENMEK ISTIYORSAN -> NASIL ELDE EDERSIN  (Run'dan sonra; .meas sonuclari: View > SPICE Error Log  [Ctrl+L])
TEXT 24 96 Left 2 ;  Ray gerilimi (3V3, +5V, 5V1, SD...)  : rayin teline tikla  ->  V(V3V3), V(V5), V(V5V1), V(V3V3_SD), V(V3V3_VDDA)...
TEXT 24 136 Left 2 ;  Ray min/max/ortalama, LDO payi       : Ctrl+L -> V3V3_MIN, V3V3_MAX, V3V3_AVG, V5_MIN, LDO_HEADROOM_MIN, VSD_MIN, VDDA_PP
TEXT 24 176 Left 2 ;  Bir elemanin akimi                   : eleman govdesine tikla (akim probu)  ->  I(C9), I(R43), I(L_BUZ) ...
TEXT 24 216 Left 2 ;  Bir elemanin harcadigi guc           : Alt + eleman govdesine tikla
TEXT 24 256 Left 2 ;  Kaynaktan cekilen akim / tepe        : I(V_EXT), I(V_USB) (negatif = kaynaktan cikan); Ctrl+L -> I_EXT_PK, I_USB_PK, I_*_AVG
TEXT 24 296 Left 2 ;  LDO cikis akimi / jonksiyon sicakligi: V(XU1:ip) [1V = 1A],  V(XU1:tj) [1V = 1 C];  Ctrl+L -> I_LDO_PK, I_LDO_AVG, TJ_LDO
TEXT 24 336 Left 2 ;  PTC sigorta sicakligi                : V(XF1:X1:t), V(XF2:X1:t) [C];  ~125 C'de acar.  Ctrl+L -> T_F1, T_F2
TEXT 24 376 Left 2 ;  Bir dalga formunun ortalama/RMS'i     : plot penceresinde iz adina Ctrl + sol tik
TEXT 24 416 Left 2 ;  Dalgalanma spektrumu (FFT)            : plot penceresinde sag tik > View > FFT
TEXT 24 456 Left 2 ;  Sicaklik taramasi                     : asagidaki ';.step param TAMB ...' satirinda ';' yerine '!' yaz
TEXT 24 496 Left 2 ;  Sadece USB / sadece BEC               : .param satirinda EXT_ON=0 veya USB_ON=0
TEXT 24 536 Left 2 ;  3V3 kisa devre / ariza testi          : IFAULT=1.5 (125 ms'de 5 ms boyunca 1.5 A)
TEXT 24 576 Left 2 ;  Yuk profilini degistirmek             : VP_* kaynaklarinin degeri = yuk akimi [A] (RPi icin guc [W])
TEXT 24 616 Left 2 ;  Kondansator DC-bias / ESR             : deger {100n*K100N} -> K... carpani .param'da; ESR/ESL sag tik > SpiceLine (Rser/Lser)
TEXT 24 656 Left 2 ;  Uzun termal analiz (PTC/LDO isinmasi) : .tran 0 30 0 1m  (birkac dakika surer)
TEXT 24 696 Left 2 ;Ag isimleri: VEXT_SRC/EXT1/VIN_DB25 = BEC tarafi, V5V1 = 5V1, VBUS/VBUS_F = USB, V5 = +5V, V3V3 = 3.3V_DIGI, PROF_* = yuk profili sinyalleri (devre degil).
TEXT 24 736 Left 2 ;Eleman adlari KiCad referanslaridir (rev1.0, 2026-10-23). V_/R_BEC/L_*CBL/B_*/VP_* = semada olmayan kaynak, kablo ve yuk modelleri.
TEXT 0 5304 Left 3 ;SIMULASYON AYARLARI
TEXT 0 5368 Left 2 !.param TAMB=25 EXT_ON=1 USB_ON=1 VEXT=5.2 VUSB=5.0 RBEC=30m RUSB=0.25 IFAULT=0 K100N=0.95 K1U=0.85 K4U7=0.55 K10U5=0.45 K10U3=0.62 RFB=0.25
TEXT 0 5416 Left 1 ;TAMB=25 : ortam sicakligi [C]
TEXT 1400 5416 Left 1 ;EXT_ON=1 : DB25 (BEC) 5V girisi: 1=var 0=yok
TEXT 2800 5416 Left 1 ;USB_ON=1 : USB-C VBUS: 1=var 0=yok
TEXT 0 5448 Left 1 ;VEXT=5.2 : BEC cikis gerilimi [V]
TEXT 1400 5448 Left 1 ;VUSB=5.0 : USB host gerilimi [V]
TEXT 2800 5448 Left 1 ;RBEC=30m : BEC cikis direnci [Ohm]
TEXT 0 5480 Left 1 ;RUSB=0.25 : USB port + 1m kablo direnci [Ohm]
TEXT 1400 5480 Left 1 ;IFAULT=0 : 3V3 ariza akimi (125ms'de 5ms) [A]
TEXT 2800 5480 Left 1 ;K100N=0.95 : 100nF X7R DC-bias carpani
TEXT 0 5512 Left 1 ;K1U=0.85 : 1uF X5R @3.3V carpani
TEXT 1400 5512 Left 1 ;K4U7=0.55 : 4.7uF X5R @5V carpani
TEXT 2800 5512 Left 1 ;K10U5=0.45 : 10uF X5R @5V carpani
TEXT 0 5544 Left 1 ;K10U3=0.62 : 10uF X5R @3.3V carpani
TEXT 1400 5544 Left 1 ;RFB=0.25 : BLM18EG601SN1D DCR [Ohm]
TEXT 0 5608 Left 2 !.tran 0 150m 0 2u
TEXT 0 5648 Left 2 ;.step param TAMB list -40 25 85     <- sicaklik taramasi: bastaki ';' yerine '!' yaz
TEXT 0 5688 Left 2 ;.step param EXT_ON list 0 1         <- sadece-USB / harici giris karsilastirmasi
TEXT 0 5744 Left 3 ;OLCUMLER (.meas) - sonuclar Ctrl+L
TEXT 0 5808 Left 2 !.meas TRAN V3V3_MIN MIN V(V3V3) FROM 20m TO 150m\n.meas TRAN V3V3_MAX MAX V(V3V3) FROM 20m TO 150m\n.meas TRAN V3V3_AVG AVG V(V3V3) FROM 20m TO 150m\n.meas TRAN VSD_MIN MIN V(V3V3_SD) FROM 20m TO 150m\n.meas TRAN VDDA_PP PP V(V3V3_VDDA) FROM 20m TO 150m\n.meas TRAN V5_MIN MIN V(V5) FROM 20m TO 150m\n.meas TRAN V5V1_MIN MIN V(V5V1) FROM 20m TO 150m\n.meas TRAN LDO_HEADROOM_MIN MIN V(V5)-V(V3V3) FROM 20m TO 150m\n.meas TRAN I_LDO_PK MAX V(XU1:ip) FROM 20m TO 150m\n.meas TRAN I_LDO_AVG AVG V(XU1:ip) FROM 20m TO 150m\n.meas TRAN TJ_LDO MAX V(XU1:tj)\n.meas TRAN I_EXT_PK MAX -I(V_EXT) FROM 5m TO 150m\n.meas TRAN I_USB_PK MAX -I(V_USB) FROM 2m TO 150m\n.meas TRAN I_USB_AVG AVG -I(V_USB) FROM 20m TO 150m\n.meas TRAN I_EXT_AVG AVG -I(V_EXT) FROM 20m TO 150m\n.meas TRAN T_F1 MAX V(XF1:X1:t)\n.meas TRAN T_F2 MAX V(XF2:X1:t)\n.meas TRAN VBUZ_PK MAX V(BUZ_D) FROM 40m TO 125m
TEXT 0 6416 Left 3 ;MODEL KUTUPHANESI (gomulu) - LD39150, PTC, SS34, TVS, LED, AO3400A, fonksiyonlar
TEXT 0 6480 Left 2 !*======================================================================\n* KAPGAN FCU - GUC AGI MODEL KUTUPHANESI (LTspice'a gomulu)\n*======================================================================\n* Ortak global parametre: TAMB (ortam sicakligi, C). Tum termal\n* modeller ve diyot/LED/MOSFET instance sicakliklari TAMB'a baglidir.\n*\n* --- LD39150DT33 : 1.5A ULDO, BiCMOS, DPAK ---------------------------\n* Datasheet (ST DocID13159): Vdrop 200mV@1.5A / 40mV@300mA (typ),\n* 400mV max (-40..125C); Iq 1mA typ, 2.5mA max; Isc 3A;\n* line reg 0.04% (VO+1..6V); load reg 0.06%/A typ; SVR 65dB@120Hz;\n* TSD 170C, histerezis 10C; Rth j-c 8C/W.\n* Model: termal Foster agi (Tj dugumu), Tj'ye bagli Ron/Vref/Ilim/Iq,\n* PI hata yukselteci + anti-windup, gecis elemani kutbu, UVLO, soft-start,\n* termal kapanma (histerezisli), PMOS govde diyotu (OUT->IN ters akim).\n.subckt LD39150_33 IN OUT GND params: VNOM=3.3 RON25=0.133 ISC=3.0 IQ0=1m\n+ RJC=8 CJC=0.03 RCA=50 CCA=1.2 TSD=170 TSDH=10 UVLO=2.25 TSS=150u\n+ GM=30 FI=3k GDC=505 FP=1Meg KLINE=2.35e-4 TC1=20u TC2=-0.6u\n* -- termal (V(tj) = jonksiyon sicakligi, C)\nBamb amb 0 V={TAMB}\nRjc tj tc {RJC}\nCjc tj tc {CJC}\nRca tc amb {RCA}\nCca tc amb {CCA}\nBpd 0 tj I=max(V(IN,OUT),0)*V(ip)+max(V(IN,GND),0)*V(ig)\n* -- termal kapanma (histerezisli Schmitt)\nBtsd ts0 0 V=0.5*(1+tanh((V(tj)-({TSD}-{TSDH}*V(tsd)))/0.5))\nRts ts0 tsd 1k\nCts tsd 0 1n\n* -- UVLO (100mV histerezis) ve etkinlestirme\nBen en0 0 V=0.5*(1+tanh((V(IN,GND)-({UVLO}-0.1*V(en)))/0.02))*(1-V(tsd))\nRen en0 en 1k\nCen en 0 1n\n* -- referans: sicaklik egrisi + hat regulasyonu + soft-start\nBvt vt 0 V={VNOM}*(1+{TC1}*(V(tj)-25)+{TC2}*(V(tj)-25)*(V(tj)-25))*(1+{KLINE}*(V(IN,GND)-4.3))*V(en)+V(GND)\nRss vt vr 1k\nCss vr 0 {TSS/1k}\n* -- PI hata yukselteci (A/V), anti-windup, sizinti -> sonlu DC kazanc (yuk reg.)\nBerr err 0 V=V(vr)-V(OUT)\nBint 0 vi I=1u*({GM}*6.2832*{FI}*V(err)-1e6*(V(raw)-V(isat))-V(vi)*6.2832*{FI}/({GDC}/{GM}-1)-(1-V(en))*1e6*V(vi))\nCint vi 0 1u\nBraw raw 0 V={GM}*V(err)+V(vi)\nBsat isat 0 V=max(min(V(raw),{ISC}*(1-0.002*(V(tj)-25))),0)*V(en)\nRgp isat ig1 1k\nCgp ig1 0 {1/(6.2832*FP*1k)}\n* -- gecis elemani: dropout bolgesinde Ron(Tj), regulasyonda akim kaynagi\nBip 0 ip I=(0.5*(V(IN,OUT)+sqrt(V(IN,OUT)*V(IN,OUT)+1e-6)))/({RON25}*(1+0.004*(V(tj)-25)))*tanh(max(V(ig1),0)*{RON25}*(1+0.004*(V(tj)-25))/(0.5*(V(IN,OUT)+sqrt(V(IN,OUT)*V(IN,OUT)+1e-6))+1m))\nRip ip 0 1\nCip ip 0 1n\nBpass IN OUT I=V(ip)\nDbody OUT IN DBODY_LD\n.model DBODY_LD D(IS=1e-11 N=1.1 RS=0.05 CJO=200p)\n* -- toprak (quiescent) akimi: Iq(Tj) + dropout'ta artis\nBig ig 0 V=1u+V(en)*({IQ0}*(1+0.003*(V(tj)-25))+0.8m*0.5*(1+tanh((0.05-V(IN,OUT)+V(ip)*{RON25})/0.02)))\nBgnd IN GND I=V(ig)\nCini IN GND 100p\nCouti OUT GND 50p\nRbl OUT GND 2Meg\n.ends LD39150_33\n*\n* --- POLIMER PTC (elektro-termal, latching) ---------------------------\n* R(T)=R0*(1+TCR*(T-25))*(1+KJ/(1+exp(-(T-TTRIP)/2.5)))\n* I^2R isinmasi -> RTH/CTH -> T ; TTRIP civarinda 4 dekad sicrama.\n.subckt PTC_POLY A B params: R0=0.1 RTH=195 CTH=9m TTRIP=125 KJ=1e4 TCR=0.008\nBamb amb 0 V={TAMB}\nBr A B I=V(A,B)/({R0}*(1+{TCR}*(V(t)-25))*(1+{KJ}/(1+exp(-(V(t)-{TTRIP})/2.5))))\nBp 0 t I=V(A,B)*V(A,B)/({R0}*(1+{TCR}*(V(t)-25))*(1+{KJ}/(1+exp(-(V(t)-{TTRIP})/2.5))))\nRth t amb {RTH}\nCth t amb {CTH}\n.ends PTC_POLY\n* F1: 1206 1.1A-hold sinifi (MF-MSMF110 benzeri) ; F2: 2920 2A-hold sinifi\n.subckt PTC_1206_1A1 A B\nX1 A B PTC_POLY R0=0.10 RTH=195 CTH=9m\n.ends PTC_1206_1A1\n.subckt PTC_2920_2A A B\nX1 A B PTC_POLY R0=0.045 RTH=111 CTH=0.15\n.ends PTC_2920_2A\n*\n* --- SS34 Schottky (40V/3A, SMA) ELEKTRO-TERMAL -----------------------\n* Vf: ~0.31V@0.1A, 0.41V@1A, 0.50V@3A (25C); Ir: ~5uA@40V/25C,\n* ~2mA@100C; Eg=0.69 (Schottky), XTI=2; oz isinma Rth(j-a)=85C/W.\n.subckt SS34_ET A K params: IS0=5u N=1.2 RS=0.03 XTI=2 EG=0.69 BV=46 IBV=0.5m RTH=85 CTH=0.05 CJ=250p\nBamb amb 0 V={TAMB}\nRrs A ja {RS}\nBd ja K I={IS0}*exp({XTI}/{N}*ln((V(t)+273.15)/298.15)+{EG}/({N}*8.617e-5*(V(t)+273.15))*((V(t)+273.15)/298.15-1))*(exp(min(V(ja,K)/({N}*8.617e-5*(V(t)+273.15)),40))*(1+max(V(ja,K)/({N}*8.617e-5*(V(t)+273.15))-40,0))-1)-{IBV}*exp(min((-V(ja,K)-{BV})/(1.5*8.617e-5*(V(t)+273.15)),40))\nCj ja K {CJ}\nBp 0 t I=max(V(A,K)*V(A,ja)/{RS},0)\nRth t amb {RTH}\nCth t amb {CTH}\n.ends SS34_ET\n*\n* --- TVS / ESD diyotlari ---------------------------------------------\n* SMAJ6.0A: VR=6.0V, VBR 6.67..7.37V@10mA, VC=10.3V@38.8A, alpha(VBR)~5.7e-4/C\n.model SMAJ6V0A D(IS=2e-12 N=1.1 RS=0.012 BV=6.95 IBV=10m NBV=1.4 TBV1=5.7e-4 CJO=3.2n VJ=0.8 M=0.4 TT=50n EG=1.11 XTI=3)\n* USBLC6-2SC6 VBUS-GND zener yolu: VBR~6.1V, sizinti <150nA@5V\n.model USBLC6_Z D(IS=1e-14 N=1.05 RS=0.5 BV=6.1 IBV=1m NBV=1.2 TBV1=6e-4 CJO=60p)\n*\n* --- LED'ler (0603, tipik egriler; tempco ~-2..-3mV/C) ---------------\n.model LED_BLUE  D(IS=1.3e-21 N=2.595 RS=8 EG=1.38 XTI=3 CJO=40p BV=5 IBV=10u)\n.model LED_GREEN D(IS=2.34e-21 N=1.769 RS=6 EG=1.36 XTI=3 CJO=30p BV=5 IBV=10u)\n.model LED_RED   D(IS=2.22e-18 N=2.012 RS=5 EG=1.14 XTI=3 CJO=30p BV=5 IBV=10u)\n.model LED_AMBER D(IS=8.43e-19 N=2.012 RS=5 EG=1.14 XTI=3 CJO=30p BV=5 IBV=10u)\n*\n* --- AO3400A N-MOSFET (30V, 28mOhm@4.5V, Vth~1.05V, Ciss~630p) -------\n.model AO3400A VDMOS(Rg=1.5 Vto=1.05 Kp=19 Lambda=0.02 Rd=8m Rs=5m Rb=12m Cgdmax=200p Cgdmin=30p Cgs=550p Cjo=110p M=0.5 Is=2e-12 N=1.1 BV=30 Ksubthres=0.1 Bex=-1.5 Vtotc=-3m mfg=AOS Vds=30 Ron=28m Qg=7n)\n*\n* --- MCU GPIO cikis kati (yuksek-taraf ~40 Ohm, yumusak gecis) --------\n.model SW_GPIO SW(Ron=40 Roff=100Meg Vt=1.65 Vh=-0.3)\n*\n* --- yuk davranis fonksiyonlari --------------------------------------\n* CMOS dijital yuk: akim ~ V (C*V*f), POR esigi altinda ~0\n.func fcmos(v,von) {max(v,0)/3.3*0.5*(1+tanh((v-von)/0.08))}\n* SMPS/PMIC girisi: sabit guc, UVLO altinda kapali\n.func fpsu(p,v,vuv) {p/max(v,3.5)*0.5*(1+tanh((v-vuv)/0.05))}
RECTANGLE Normal 1776 2136 2160 2392 2
RECTANGLE Normal 0 0 4200 808 2

The netlist it stands for:
* Kapgan_Guc_Agi.asc
V_EXT VEXT_SRC 0 PWL(0 0 1m 0 3m {VEXT*EXT_ON})
R_BEC VEXT_SRC EXT1 {RBEC}
L_EXTCBL EXT1 VIN_DB25 0.5µ Rser=15m
X§XF1 VIN_DB25 V5V1 PTC_2920_2A  ; pins A B
D1 0 V5V1 SMAJ6V0A temp={TAMB}
C41 V5V1 0 100µ V=16 Rser=0.34 Lser=3n Rpar=1Meg
C5 V5V1 0 {100n*K100N} Rser=30m Lser=0.6n
C42 V5V1 0 {100n*K100N} Rser=30m Lser=0.6n
C6 V5V1 0 {10u*K10U5} Rser=4m Lser=0.8n
X§XD2 V5V1 V5 SS34_ET  ; pins + -
V_USB VUSB_SRC 0 PWL(0 0 2m 0 2.1m {VUSB*USB_ON})
R_USBH VUSB_SRC USB1 {RUSB}
L_USBCBL USB1 VBUS 1µ Rser=0
C31 VBUS 0 {100n*K100N} Rser=30m Lser=0.6n
C29 VBUS 0 {4.7u*K4U7} Rser=6m Lser=0.75n
D_U9 0 VBUS USBLC6_Z temp={TAMB}
R81 VBUS P001 330
D11 P001 0 LED_AMBER temp={TAMB}
X§XF2 VBUS VBUS_F PTC_1206_1A1  ; pins A B
X§XD3 VBUS_F V5 SS34_ET  ; pins + -
C4 V5 0 {4.7u*K4U7} Rser=6m Lser=0.75n
C3 V5 0 {100n*K100N} Rser=30m Lser=0.6n
R37 V5 P002 330
D8 P002 0 LED_RED temp={TAMB}
L_BUZ V5 BUZ_D 2m Rser=80 Rpar=5k
X§XD7 BUZ_D V5 SS34_ET  ; pins + -
M§Q1 BUZ_D BUZ_G 0 0 AO3400A temp={TAMB}
R7 BUZ_G 0 10k
R5 BUZ_PWM BUZ_G 1k
V_BUZPWM BUZ_PWM 0 PULSE(0 3.3 40m 20n 20n 185u 370u 216)
C9 V3V3 0 {10u*K10U3} Rser=4m Lser=0.8n
C22 V3V3 0 {100n*K100N} Rser=30m Lser=0.6n
B_RPI V5V1 0 I=fpsu(V(PROF_PI1)+V(PROF_PI2),V(V5V1),4.0)
B_PI3V3 PI3_INT 0 V=min(3.3,max(V(V5V1)-0.25,0))*0.5*(1+tanh((V(V5V1)-4.0)/0.05))
R_PI3 PI3_INT PI_3V3 0.05
C27 PI_3V3 0 {100n*K100N} Rser=30m Lser=0.6n
C44 PI_3V3 0 {100n*K100N} Rser=30m Lser=0.6n
B_U7U11 PI_3V3 0 I=50u*fcmos(V(PI_3V3),1.2)
VP_PI_BASE PROF_PI1 0 PWL(0 0 3m 0 4m 1.6 60m 1.6 60.05m 2.6 110m 2.6 110.05m 1.6)
VP_PI_WIFI PROF_PI2 0 PULSE(0 1.2 10m 20u 20u 1.5m 10m)
C8 V3V3 0 {10u*K10U3} Rser=4m Lser=0.8n
C16 V3V3 0 {100n*K100N} Rser=30m Lser=0.6n
C20 V3V3 0 {100n*K100N} Rser=30m Lser=0.6n
C24 V3V3 0 {100n*K100N} Rser=30m Lser=0.6n
C34 V3V3 0 {100n*K100N} Rser=30m Lser=0.6n
C7 V3V3 0 {100n*K100N} Rser=30m Lser=0.6n
B_MCU V3V3 0 I=(V(PROF_MCU)+V(PROF_MCUFL))*fcmos(V(V3V3),1.75)
S_GPIO_LED V3V3 N_GPIO LED_CTL 0 SW_GPIO
R36 N_GPIO P003 330
D9 P003 0 LED_BLUE temp={TAMB}
R43 V3V3 P004 330
D10 P004 0 LED_GREEN temp={TAMB}
VP_MCU PROF_MCU 0 PULSE(60m 115m 5m 2u 2u 80u 1m)
VP_MCUFL PROF_MCUFL 0 PULSE(0 25m 15m 10u 10u 2m 50m)
V_LEDCTL LED_CTL 0 PULSE(0 3.3 20m 1u 1u 25m 50m)
C28 V3V3 0 {100n*K100N} Rser=30m Lser=0.6n
B_CAN V3V3 0 I=V(PROF_CAN)*fcmos(V(V3V3),2.6)
B_I2C_PU V3V3 0 I=V(PROF_I2C)*max(V(V3V3),0)/3.3
C10 V3V3 0 {100n*K100N} Rser=30m Lser=0.6n
C14 V3V3 0 {100n*K100N} Rser=30m Lser=0.6n
B_IMU_IO V3V3 0 I=0.3m*fcmos(V(V3V3),1.5)
C18 V3V3 0 {100n*K100N} Rser=30m Lser=0.6n
C40 V3V3 0 {100n*K100N} Rser=30m Lser=0.6n
C21 V3V3 0 {100n*K100N} Rser=30m Lser=0.6n
B_LOGIC V3V3 0 I=0.1m*fcmos(V(V3V3),1.2)
B_FAULT V3V3 0 I=V(PROF_FLT)*min(max(V(V3V3),0)/0.5,1)
VP_CAN PROF_CAN 0 PULSE(10m 17m 5m 50n 50n 110u 1m)
VP_I2C PROF_I2C 0 PULSE(0 3m 2.5m 100n 100n 40u 1m)
VP_FAULT PROF_FLT 0 PULSE(0 {IFAULT} 125m 1u 1u 5m 1)
L§FB4 V3V3 V3V3_VDDA 1µ Rser={RFB} Rpar=650 Cpar=1.2p
C36 V3V3_VDDA 0 {1u*K1U} Rser=12m Lser=0.6n
C33 V3V3_VDDA 0 {100n*K100N} Rser=30m Lser=0.6n
B_VDDA V3V3_VDDA 0 I=1.6m*fcmos(V(V3V3_VDDA),1.7)
L§FB2 V3V3 V3V3_BMI 1µ Rser={RFB} Rpar=650 Cpar=1.2p
C13 V3V3_BMI 0 {1u*K1U} Rser=12m Lser=0.6n
C11 V3V3_BMI 0 {100n*K100N} Rser=30m Lser=0.6n
B_BMI270 V3V3_BMI 0 I=V(PROF_BMI)*fcmos(V(V3V3_BMI),1.5)
VP_BMI PROF_BMI 0 PULSE(0.69m 0.95m 3m 5u 5u 100u 625u)
L§FB3 V3V3 V3V3_MPU 1µ Rser={RFB} Rpar=650 Cpar=1.2p
C17 V3V3_MPU 0 {1u*K1U} Rser=12m Lser=0.6n
C26 V3V3_MPU 0 {10n*K100N} Rser=60m Lser=0.6n
B_MPU6500 V3V3_MPU 0 I=V(PROF_MPU)*fcmos(V(V3V3_MPU),1.6)
VP_MPU PROF_MPU 0 PULSE(3.2m 3.8m 3m 5u 5u 100u 1m)
L§FB1 V3V3 V3V3_BMP 1µ Rser={RFB} Rpar=650 Cpar=1.2p
C12 V3V3_BMP 0 {100n*K100N} Rser=30m Lser=0.6n
C23 V3V3_BMP 0 {100n*K100N} Rser=30m Lser=0.6n
B_BMP280 V3V3_BMP 0 I=V(PROF_BMP)*fcmos(V(V3V3_BMP),1.5)
VP_BMP PROF_BMP 0 PULSE(3u 1.12m 4m 10u 10u 6.4m 25m)
L§FB5 V3V3 V3V3_SD 1µ Rser={RFB} Rpar=650 Cpar=1.2p
C30 V3V3_SD 0 {100n*K100N} Rser=30m Lser=0.6n
C38 V3V3_SD 0 {10u*K10U3} Rser=4m Lser=0.8n
B_SDCARD V3V3_SD 0 I=V(PROF_SD)*fcmos(V(V3V3_SD),2.7)
VP_SD PROF_SD 0 PWL REPEAT FOREVER (0 1m 30m 1m 30.005m 150m 30.2m 150m 30.205m 90m 33m 90m 33.005m 1m 50m 1m) ENDREPEAT
.model D D
.lib standard.dio
.model NMOS NMOS
.model PMOS PMOS
.lib standard.mos
* 1) GIRIS-1: DB25 (J2) harici 5V / BEC  ->  F1 (2A PTC)  ->  5V1  ->  D2 (SS34)  ->  +5V
* BEC kaynagi + kablo + konnektor modeli; 5V1 dogrudan RPi Zero 2W'yi (J1) besler. D2/D3 = diyot-VEYA.
* BEC (EXT_ON ile ac/kapa)
* TVS SMAJ6.0A
* elektrolitik
* 2) GIRIS-2: USB-C (J4) VBUS  ->  F2 (1A PTC)  ->  D3 (SS34)  ->  +5V
* USB host portu + kablo enduktansi (sicak takma ani akimi). U9 USBLC6 VBUS kenetlemesi, D11 amber VBUS LED'i.
* USB host (USB_ON)
* U9 USBLC6 VBUS-GND
* VBUS LED
* 3) +5V RAYI: LED, buzzer (J3, Q1 AO3400A, D7 flyback), U1 LD39150DT33 LDO  ->  3V3_DIGI
* LDO alt devresi kutu icindeki XU1 satiri ile cagrilir (pinler: IN=V5, OUT=V3V3, GND=0).
* +5V LED
* MCU PC13 (BUZZER) -> R5 -> Q1 kapisi (2.7 kHz)
* J3 buzzer (2mH/80R)
* U1  LD39150DT33
* 1.5A ULDO (DPAK)
XU1 V5 V3V3 0 LD39150_33
* IN
* OUT
* GND
* 4) RPi ZERO 2W (J1, 5V1 rayindan) + PI_3V3 (Pi'nin kendi 3V3 cikisi)
* Sabit-guc yuk: P/V, PMIC UVLO ~4.0V. Profil = VP_PI_BASE (W) + VP_PI_WIFI (W).
* Pi PMIC 3V3 (V5V1'e bagli)
* 5) 3V3_DIGI: STM32F405 (U2) VDD dekuplaji, MCU akimi, LED'ler
* B_MCU = MCU cekirdek+cevre akimi (profil VP_MCU + flash yazma VP_MCUFL), D9 mavi LED MCU pini (PB4) ile surulur.
* MCU_LED (GPIO)
* 3V3 LED
* 6) 3V3_DIGI: CAN (SN65HVD230), I2C pull-up'lar, sensor VDDIO'lari, lojik, ariza senaryosu
* 7) FERRIT FILTRELI KOLLAR (BLM18EG601SN1D): VDDA, BMI270, MPU-6500, BMP280, microSD
* STM32 VDDA
* BMI270 VDD (U5)
* MPU-6500 VDD (U4)
* BMP280 (U3)
* microSD (J5)
* SD yazma: 200us 150mA tepe, 90mA mesgul, 20ms periyot
* KAPGAN FCU - GUC AGI SIMULASYONU  (kocapilot Kapgan.kicad_sch + Kapgan.kicad_sch, rev1.0)
* Tum modeller dosyaya gomulu (alt kisimda). Yukler = ters yonlu akim kaynaklari (B-I). Tum dosya ASCII.
* NE OGRENMEK ISTIYORSAN -> NASIL ELDE EDERSIN  (Run'dan sonra; .meas sonuclari: View > SPICE Error Log  [Ctrl+L])
*   Ray gerilimi (3V3, +5V, 5V1, SD...)  : rayin teline tikla  ->  V(V3V3), V(V5), V(V5V1), V(V3V3_SD), V(V3V3_VDDA)...
*   Ray min/max/ortalama, LDO payi       : Ctrl+L -> V3V3_MIN, V3V3_MAX, V3V3_AVG, V5_MIN, LDO_HEADROOM_MIN, VSD_MIN, VDDA_PP
*   Bir elemanin akimi                   : eleman govdesine tikla (akim probu)  ->  I(C9), I(R43), I(L_BUZ) ...
*   Bir elemanin harcadigi guc           : Alt + eleman govdesine tikla
*   Kaynaktan cekilen akim / tepe        : I(V_EXT), I(V_USB) (negatif = kaynaktan cikan); Ctrl+L -> I_EXT_PK, I_USB_PK, I_*_AVG
*   LDO cikis akimi / jonksiyon sicakligi: V(XU1:ip) [1V = 1A],  V(XU1:tj) [1V = 1 C];  Ctrl+L -> I_LDO_PK, I_LDO_AVG, TJ_LDO
*   PTC sigorta sicakligi                : V(XF1:X1:t), V(XF2:X1:t) [C];  ~125 C'de acar.  Ctrl+L -> T_F1, T_F2
*   Bir dalga formunun ortalama/RMS'i     : plot penceresinde iz adina Ctrl + sol tik
*   Dalgalanma spektrumu (FFT)            : plot penceresinde sag tik > View > FFT
*   Sicaklik taramasi                     : asagidaki ';.step param TAMB ...' satirinda ';' yerine '!' yaz
*   Sadece USB / sadece BEC               : .param satirinda EXT_ON=0 veya USB_ON=0
*   3V3 kisa devre / ariza testi          : IFAULT=1.5 (125 ms'de 5 ms boyunca 1.5 A)
*   Yuk profilini degistirmek             : VP_* kaynaklarinin degeri = yuk akimi [A] (RPi icin guc [W])
*   Kondansator DC-bias / ESR             : deger {100n*K100N} -> K... carpani .param'da; ESR/ESL sag tik > SpiceLine (Rser/Lser)
*   Uzun termal analiz (PTC/LDO isinmasi) : .tran 0 30 0 1m  (birkac dakika surer)
* Ag isimleri: VEXT_SRC/EXT1/VIN_DB25 = BEC tarafi, V5V1 = 5V1, VBUS/VBUS_F = USB, V5 = +5V, V3V3 = 3.3V_DIGI, PROF_* = yuk profili sinyalleri (devre degil).
* Eleman adlari KiCad referanslaridir (rev1.0, 2026-10-23). V_/R_BEC/L_*CBL/B_*/VP_* = semada olmayan kaynak, kablo ve yuk modelleri.
* SIMULASYON AYARLARI
.param TAMB=25 EXT_ON=1 USB_ON=1 VEXT=5.2 VUSB=5.0 RBEC=30m RUSB=0.25 IFAULT=0 K100N=0.95 K1U=0.85 K4U7=0.55 K10U5=0.45 K10U3=0.62 RFB=0.25
* TAMB=25 : ortam sicakligi [C]
* EXT_ON=1 : DB25 (BEC) 5V girisi: 1=var 0=yok
* USB_ON=1 : USB-C VBUS: 1=var 0=yok
* VEXT=5.2 : BEC cikis gerilimi [V]
* VUSB=5.0 : USB host gerilimi [V]
* RBEC=30m : BEC cikis direnci [Ohm]
* RUSB=0.25 : USB port + 1m kablo direnci [Ohm]
* IFAULT=0 : 3V3 ariza akimi (125ms'de 5ms) [A]
* K100N=0.95 : 100nF X7R DC-bias carpani
* K1U=0.85 : 1uF X5R @3.3V carpani
* K4U7=0.55 : 4.7uF X5R @5V carpani
* K10U5=0.45 : 10uF X5R @5V carpani
* K10U3=0.62 : 10uF X5R @3.3V carpani
* RFB=0.25 : BLM18EG601SN1D DCR [Ohm]
.tran 0 150m 0 2u
* .step param TAMB list -40 25 85     <- sicaklik taramasi: bastaki ';' yerine '!' yaz
* .step param EXT_ON list 0 1         <- sadece-USB / harici giris karsilastirmasi
* OLCUMLER (.meas) - sonuclar Ctrl+L
.meas TRAN V3V3_MIN MIN V(V3V3) FROM 20m TO 150m
.meas TRAN V3V3_MAX MAX V(V3V3) FROM 20m TO 150m
.meas TRAN V3V3_AVG AVG V(V3V3) FROM 20m TO 150m
.meas TRAN VSD_MIN MIN V(V3V3_SD) FROM 20m TO 150m
.meas TRAN VDDA_PP PP V(V3V3_VDDA) FROM 20m TO 150m
.meas TRAN V5_MIN MIN V(V5) FROM 20m TO 150m
.meas TRAN V5V1_MIN MIN V(V5V1) FROM 20m TO 150m
.meas TRAN LDO_HEADROOM_MIN MIN V(V5)-V(V3V3) FROM 20m TO 150m
.meas TRAN I_LDO_PK MAX V(XU1:ip) FROM 20m TO 150m
.meas TRAN I_LDO_AVG AVG V(XU1:ip) FROM 20m TO 150m
.meas TRAN TJ_LDO MAX V(XU1:tj)
.meas TRAN I_EXT_PK MAX -I(V_EXT) FROM 5m TO 150m
.meas TRAN I_USB_PK MAX -I(V_USB) FROM 2m TO 150m
.meas TRAN I_USB_AVG AVG -I(V_USB) FROM 20m TO 150m
.meas TRAN I_EXT_AVG AVG -I(V_EXT) FROM 20m TO 150m
.meas TRAN T_F1 MAX V(XF1:X1:t)
.meas TRAN T_F2 MAX V(XF2:X1:t)
.meas TRAN VBUZ_PK MAX V(BUZ_D) FROM 40m TO 125m
* MODEL KUTUPHANESI (gomulu) - LD39150, PTC, SS34, TVS, LED, AO3400A, fonksiyonlar
*======================================================================
* KAPGAN FCU - GUC AGI MODEL KUTUPHANESI (LTspice'a gomulu)
*======================================================================
* Ortak global parametre: TAMB (ortam sicakligi, C). Tum termal
* modeller ve diyot/LED/MOSFET instance sicakliklari TAMB'a baglidir.
*
* --- LD39150DT33 : 1.5A ULDO, BiCMOS, DPAK ---------------------------
* Datasheet (ST DocID13159): Vdrop 200mV@1.5A / 40mV@300mA (typ),
* 400mV max (-40..125C); Iq 1mA typ, 2.5mA max; Isc 3A;
* line reg 0.04% (VO+1..6V); load reg 0.06%/A typ; SVR 65dB@120Hz;
* TSD 170C, histerezis 10C; Rth j-c 8C/W.
* Model: termal Foster agi (Tj dugumu), Tj'ye bagli Ron/Vref/Ilim/Iq,
* PI hata yukselteci + anti-windup, gecis elemani kutbu, UVLO, soft-start,
* termal kapanma (histerezisli), PMOS govde diyotu (OUT->IN ters akim).
.subckt LD39150_33 IN OUT GND params: VNOM=3.3 RON25=0.133 ISC=3.0 IQ0=1m
+ RJC=8 CJC=0.03 RCA=50 CCA=1.2 TSD=170 TSDH=10 UVLO=2.25 TSS=150u
+ GM=30 FI=3k GDC=505 FP=1Meg KLINE=2.35e-4 TC1=20u TC2=-0.6u
* -- termal (V(tj) = jonksiyon sicakligi, C)
Bamb amb 0 V={TAMB}
Rjc tj tc {RJC}
Cjc tj tc {CJC}
Rca tc amb {RCA}
Cca tc amb {CCA}
Bpd 0 tj I=max(V(IN,OUT),0)*V(ip)+max(V(IN,GND),0)*V(ig)
* -- termal kapanma (histerezisli Schmitt)
Btsd ts0 0 V=0.5*(1+tanh((V(tj)-({TSD}-{TSDH}*V(tsd)))/0.5))
Rts ts0 tsd 1k
Cts tsd 0 1n
* -- UVLO (100mV histerezis) ve etkinlestirme
Ben en0 0 V=0.5*(1+tanh((V(IN,GND)-({UVLO}-0.1*V(en)))/0.02))*(1-V(tsd))
Ren en0 en 1k
Cen en 0 1n
* -- referans: sicaklik egrisi + hat regulasyonu + soft-start
Bvt vt 0 V={VNOM}*(1+{TC1}*(V(tj)-25)+{TC2}*(V(tj)-25)*(V(tj)-25))*(1+{KLINE}*(V(IN,GND)-4.3))*V(en)+V(GND)
Rss vt vr 1k
Css vr 0 {TSS/1k}
* -- PI hata yukselteci (A/V), anti-windup, sizinti -> sonlu DC kazanc (yuk reg.)
Berr err 0 V=V(vr)-V(OUT)
Bint 0 vi I=1u*({GM}*6.2832*{FI}*V(err)-1e6*(V(raw)-V(isat))-V(vi)*6.2832*{FI}/({GDC}/{GM}-1)-(1-V(en))*1e6*V(vi))
Cint vi 0 1u
Braw raw 0 V={GM}*V(err)+V(vi)
Bsat isat 0 V=max(min(V(raw),{ISC}*(1-0.002*(V(tj)-25))),0)*V(en)
Rgp isat ig1 1k
Cgp ig1 0 {1/(6.2832*FP*1k)}
* -- gecis elemani: dropout bolgesinde Ron(Tj), regulasyonda akim kaynagi
Bip 0 ip I=(0.5*(V(IN,OUT)+sqrt(V(IN,OUT)*V(IN,OUT)+1e-6)))/({RON25}*(1+0.004*(V(tj)-25)))*tanh(max(V(ig1),0)*{RON25}*(1+0.004*(V(tj)-25))/(0.5*(V(IN,OUT)+sqrt(V(IN,OUT)*V(IN,OUT)+1e-6))+1m))
Rip ip 0 1
Cip ip 0 1n
Bpass IN OUT I=V(ip)
Dbody OUT IN DBODY_LD
.model DBODY_LD D(IS=1e-11 N=1.1 RS=0.05 CJO=200p)
* -- toprak (quiescent) akimi: Iq(Tj) + dropout'ta artis
Big ig 0 V=1u+V(en)*({IQ0}*(1+0.003*(V(tj)-25))+0.8m*0.5*(1+tanh((0.05-V(IN,OUT)+V(ip)*{RON25})/0.02)))
Bgnd IN GND I=V(ig)
Cini IN GND 100p
Couti OUT GND 50p
Rbl OUT GND 2Meg
.ends LD39150_33
*
* --- POLIMER PTC (elektro-termal, latching) ---------------------------
* R(T)=R0*(1+TCR*(T-25))*(1+KJ/(1+exp(-(T-TTRIP)/2.5)))
* I^2R isinmasi -> RTH/CTH -> T ; TTRIP civarinda 4 dekad sicrama.
.subckt PTC_POLY A B params: R0=0.1 RTH=195 CTH=9m TTRIP=125 KJ=1e4 TCR=0.008
Bamb amb 0 V={TAMB}
Br A B I=V(A,B)/({R0}*(1+{TCR}*(V(t)-25))*(1+{KJ}/(1+exp(-(V(t)-{TTRIP})/2.5))))
Bp 0 t I=V(A,B)*V(A,B)/({R0}*(1+{TCR}*(V(t)-25))*(1+{KJ}/(1+exp(-(V(t)-{TTRIP})/2.5))))
Rth t amb {RTH}
Cth t amb {CTH}
.ends PTC_POLY
* F1: 1206 1.1A-hold sinifi (MF-MSMF110 benzeri) ; F2: 2920 2A-hold sinifi
.subckt PTC_1206_1A1 A B
X1 A B PTC_POLY R0=0.10 RTH=195 CTH=9m
.ends PTC_1206_1A1
.subckt PTC_2920_2A A B
X1 A B PTC_POLY R0=0.045 RTH=111 CTH=0.15
.ends PTC_2920_2A
*
* --- SS34 Schottky (40V/3A, SMA) ELEKTRO-TERMAL -----------------------
* Vf: ~0.31V@0.1A, 0.41V@1A, 0.50V@3A (25C); Ir: ~5uA@40V/25C,
* ~2mA@100C; Eg=0.69 (Schottky), XTI=2; oz isinma Rth(j-a)=85C/W.
.subckt SS34_ET A K params: IS0=5u N=1.2 RS=0.03 XTI=2 EG=0.69 BV=46 IBV=0.5m RTH=85 CTH=0.05 CJ=250p
Bamb amb 0 V={TAMB}
Rrs A ja {RS}
Bd ja K I={IS0}*exp({XTI}/{N}*ln((V(t)+273.15)/298.15)+{EG}/({N}*8.617e-5*(V(t)+273.15))*((V(t)+273.15)/298.15-1))*(exp(min(V(ja,K)/({N}*8.617e-5*(V(t)+273.15)),40))*(1+max(V(ja,K)/({N}*8.617e-5*(V(t)+273.15))-40,0))-1)-{IBV}*exp(min((-V(ja,K)-{BV})/(1.5*8.617e-5*(V(t)+273.15)),40))
Cj ja K {CJ}
Bp 0 t I=max(V(A,K)*V(A,ja)/{RS},0)
Rth t amb {RTH}
Cth t amb {CTH}
.ends SS34_ET
*
* --- TVS / ESD diyotlari ---------------------------------------------
* SMAJ6.0A: VR=6.0V, VBR 6.67..7.37V@10mA, VC=10.3V@38.8A, alpha(VBR)~5.7e-4/C
.model SMAJ6V0A D(IS=2e-12 N=1.1 RS=0.012 BV=6.95 IBV=10m NBV=1.4 TBV1=5.7e-4 CJO=3.2n VJ=0.8 M=0.4 TT=50n EG=1.11 XTI=3)
* USBLC6-2SC6 VBUS-GND zener yolu: VBR~6.1V, sizinti <150nA@5V
.model USBLC6_Z D(IS=1e-14 N=1.05 RS=0.5 BV=6.1 IBV=1m NBV=1.2 TBV1=6e-4 CJO=60p)
*
* --- LED'ler (0603, tipik egriler; tempco ~-2..-3mV/C) ---------------
.model LED_BLUE  D(IS=1.3e-21 N=2.595 RS=8 EG=1.38 XTI=3 CJO=40p BV=5 IBV=10u)
.model LED_GREEN D(IS=2.34e-21 N=1.769 RS=6 EG=1.36 XTI=3 CJO=30p BV=5 IBV=10u)
.model LED_RED   D(IS=2.22e-18 N=2.012 RS=5 EG=1.14 XTI=3 CJO=30p BV=5 IBV=10u)
.model LED_AMBER D(IS=8.43e-19 N=2.012 RS=5 EG=1.14 XTI=3 CJO=30p BV=5 IBV=10u)
*
* --- AO3400A N-MOSFET (30V, 28mOhm@4.5V, Vth~1.05V, Ciss~630p) -------
.model AO3400A VDMOS(Rg=1.5 Vto=1.05 Kp=19 Lambda=0.02 Rd=8m Rs=5m Rb=12m Cgdmax=200p Cgdmin=30p Cgs=550p Cjo=110p M=0.5 Is=2e-12 N=1.1 BV=30 Ksubthres=0.1 Bex=-1.5 Vtotc=-3m mfg=AOS Vds=30 Ron=28m Qg=7n)
*
* --- MCU GPIO cikis kati (yuksek-taraf ~40 Ohm, yumusak gecis) --------
.model SW_GPIO SW(Ron=40 Roff=100Meg Vt=1.65 Vh=-0.3)
*
* --- yuk davranis fonksiyonlari --------------------------------------
* CMOS dijital yuk: akim ~ V (C*V*f), POR esigi altinda ~0
.func fcmos(v,von) {max(v,0)/3.3*0.5*(1+tanh((v-von)/0.08))}
* SMPS/PMIC girisi: sabit guc, UVLO altinda kapali
.func fpsu(p,v,vuv) {p/max(v,3.5)*0.5*(1+tanh((v-vuv)/0.05))}
.backanno
.end